# EAGLE schematic 6502_nes_book (EAGLE 6.4), part 1 of 5

## Sheet 1 of 29
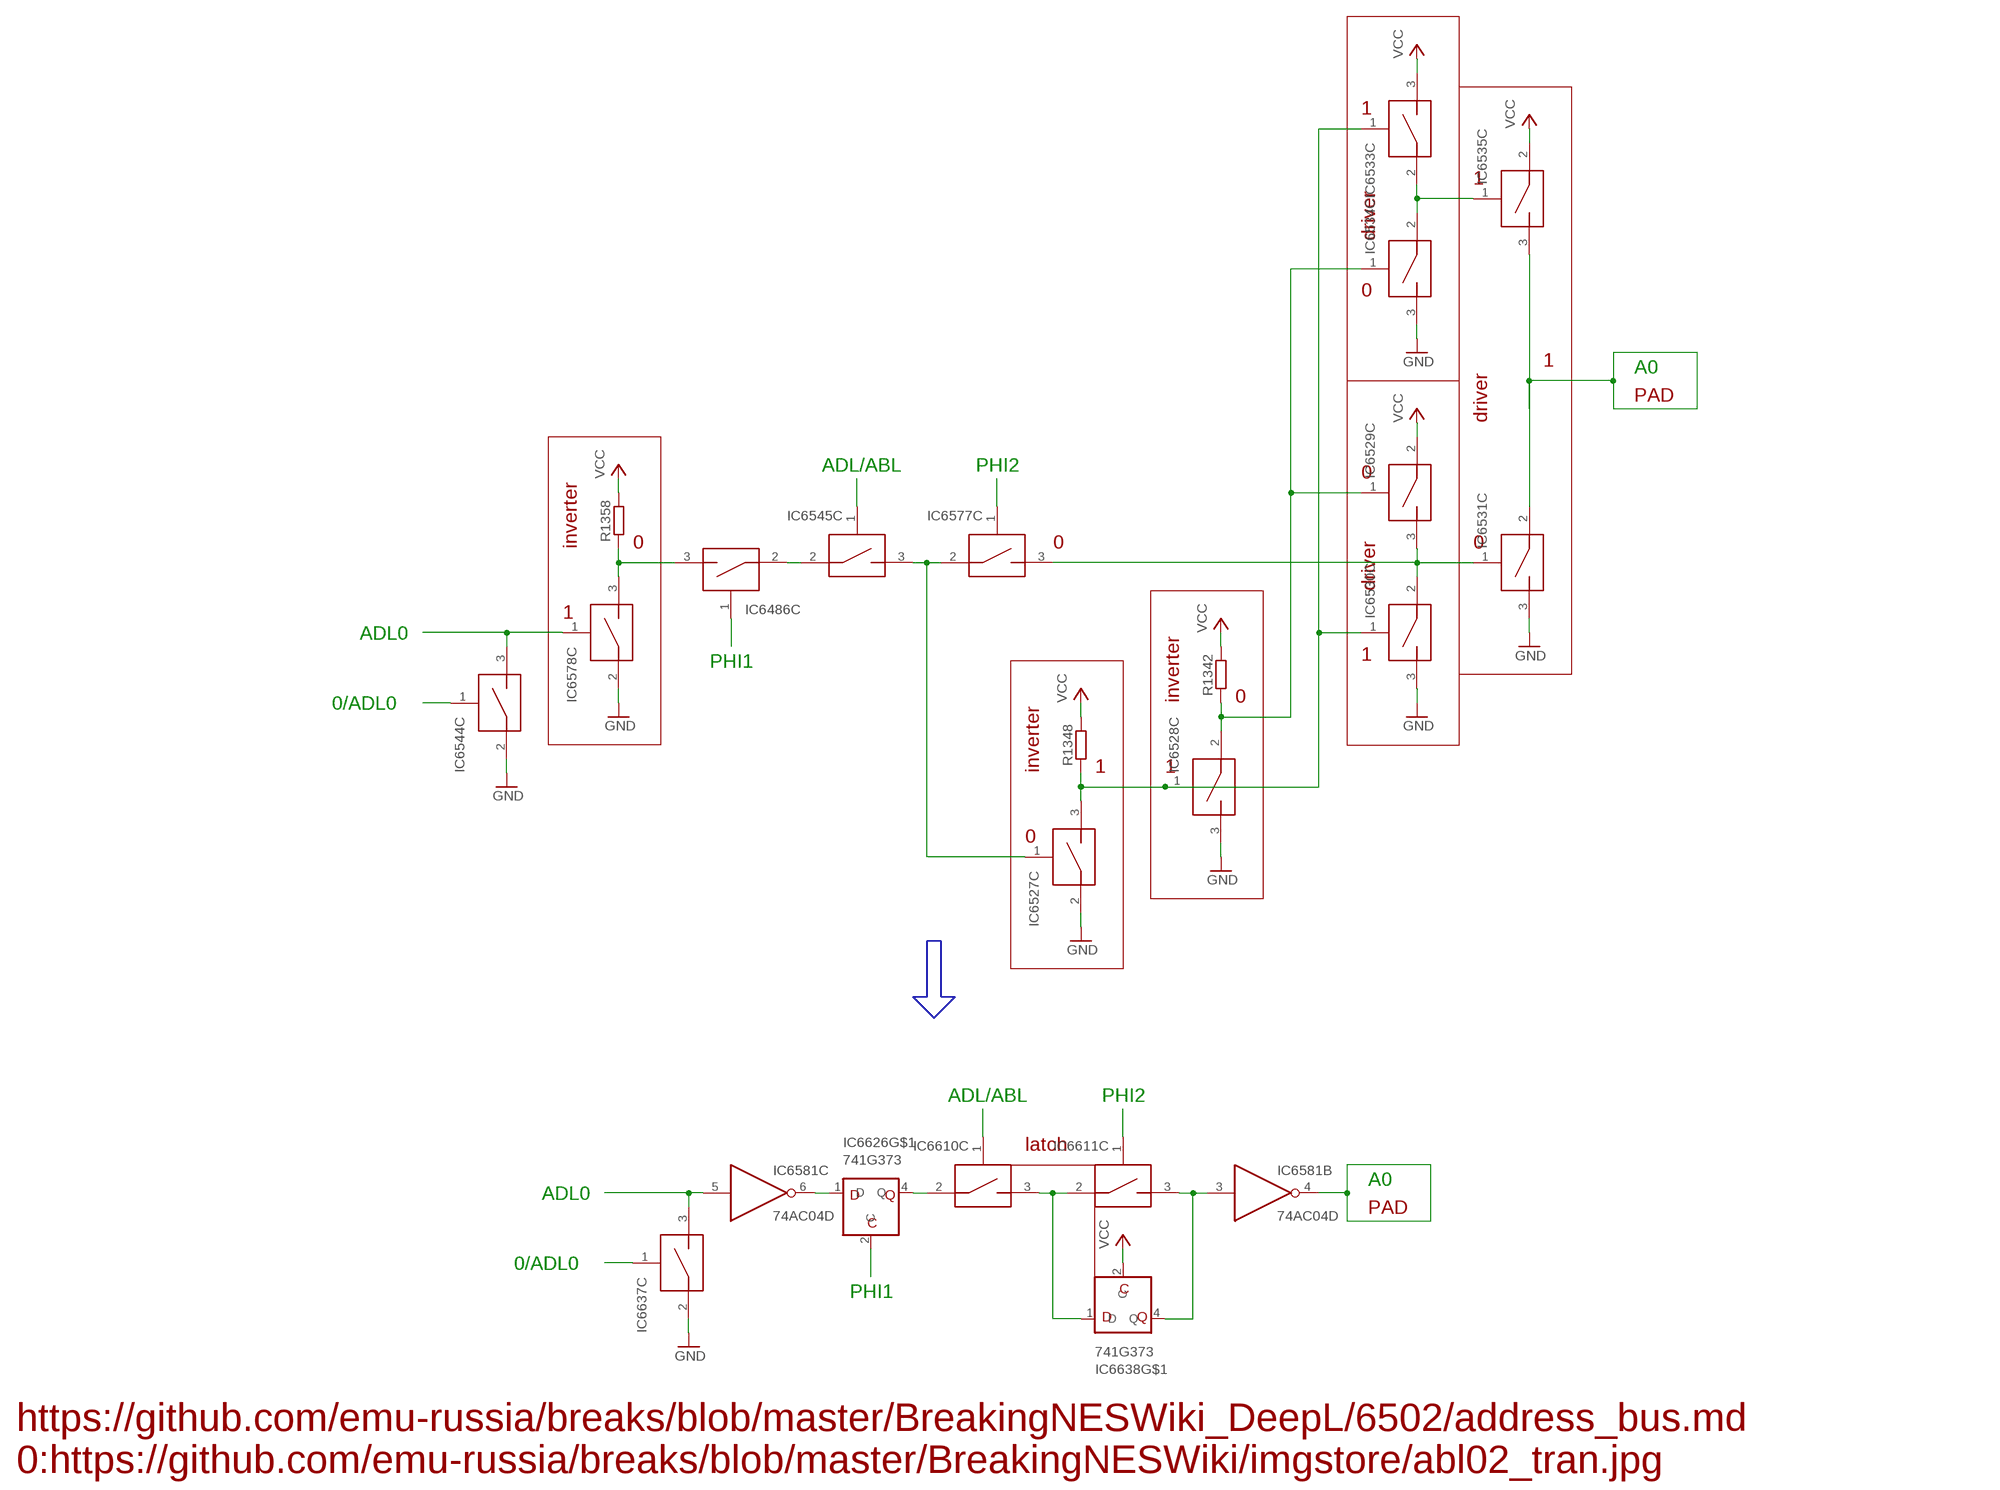
[diagram p0: schematic, sheet 1]

### Parts
IC6486  MAX4613SO16  [SO16]
IC6527  MAX4613SO16  [SO16]
IC6528  MAX4613SO16  [SO16]
IC6529  MAX4613SO16  [SO16]
IC6530  MAX4613SO16  [SO16]
IC6531  MAX4613SO16  [SO16]
IC6533  MAX4613SO16  [SO16]
IC6534  MAX4613SO16  [SO16]
IC6535  MAX4613SO16  [SO16]
IC6544  MAX4613SO16  [SO16]
IC6545  MAX4613SO16  [SO16]
IC6577  MAX4613SO16  [SO16]
IC6578  MAX4613SO16  [SO16]
IC6581  74AC04D  [SO14]
IC6610  MAX4613SO16  [SO16]
IC6611  MAX4613SO16  [SO16]
IC6626  741G373  [DBV-R-PDSO-G5]
IC6637  MAX4613SO16  [SO16]
IC6638  741G373  [DBV-R-PDSO-G5]
R1342  R-EU_R0603  [R0603]
R1348  R-EU_R0603  [R0603]
R1358  R-EU_R0603  [R0603]

### Nets
GND: IC6527.2 IC6528.3 IC6530.3 IC6531.3 IC6534.3 IC6544.2 IC6578.2 IC6637.2 ; also sheet 2,3,4,9,10,11,12,13,14,19,20,21,22,23
N$11706: IC6486.3 IC6578.3 R1358.1
N$11709: IC6544.3 IC6578.1
N$11939: IC6486.1
N$11941: IC6527.3 IC6528.1 IC6530.1 IC6533.1 R1348.1
N$11942: IC6527.1 IC6545.3 IC6577.2
N$11995: IC6533.2 IC6534.2 IC6535.1
N$12003: IC6531.2 IC6535.3
N$12008: IC6529.3 IC6530.2 IC6531.1 IC6577.3
N$12009: IC6544.1
N$12011: IC6545.1
N$12012: IC6486.2 IC6545.2
N$12013: IC6577.1
N$12015: IC6528.2 IC6529.1 IC6534.1 R1342.1
N$12016: IC6581.4(B:O)
N$12246: IC6610.1
N$12247: IC6611.1
N$12248: IC6610.3 IC6611.2 IC6638.1(D)
N$12249: IC6626.2(C)
N$12251: IC6581.5(C:I) IC6637.3
N$12252: IC6637.1
N$12253: IC6581.6(C:O) IC6626.1(D)
N$12254: IC6610.2 IC6626.4(Q)
N$12255: IC6581.3(B:I) IC6611.3 IC6638.4(Q)
VCC: IC6529.2 IC6533.3 IC6535.2 IC6638.2(C) R1342.2 R1348.2 R1358.2 ; also sheet 2,3,4,9,11,12,13,19,20,21,22,23,26
Unconnected: IC6486.4(PWR:V-) IC6486.5(PWR:GND) IC6486.6 IC6486.7 IC6486.8 IC6486.9 IC6486.10 IC6486.11 IC6486.12(PWR:VCC) IC6486.13(PWR:V+) IC6486.14 IC6486.15 IC6486.16 IC6527.4(PWR:V-) IC6527.5(PWR:GND) IC6527.6 IC6527.7 IC6527.8 IC6527.9 IC6527.10 IC6527.11 IC6527.12(PWR:VCC) IC6527.13(PWR:V+) IC6527.14 IC6527.15 IC6527.16 IC6528.4(PWR:V-) IC6528.5(PWR:GND) IC6528.6 IC6528.7 IC6528.8 IC6528.9 IC6528.10 IC6528.11 IC6528.12(PWR:VCC) IC6528.13(PWR:V+) IC6528.14 IC6528.15 IC6528.16 IC6529.4(PWR:V-) IC6529.5(PWR:GND) IC6529.6 IC6529.7 IC6529.8 IC6529.9 IC6529.10 IC6529.11 IC6529.12(PWR:VCC) IC6529.13(PWR:V+) IC6529.14 IC6529.15 IC6529.16 IC6530.4(PWR:V-) IC6530.5(PWR:GND) IC6530.6 IC6530.7 IC6530.8 IC6530.9 IC6530.10 IC6530.11 IC6530.12(PWR:VCC) IC6530.13(PWR:V+) IC6530.14 IC6530.15 IC6530.16 IC6531.4(PWR:V-) IC6531.5(PWR:GND) IC6531.6 IC6531.7 IC6531.8 IC6531.9 IC6531.10 IC6531.11 IC6531.12(PWR:VCC) IC6531.13(PWR:V+) IC6531.14 IC6531.15 IC6531.16 IC6533.4(PWR:V-) IC6533.5(PWR:GND) IC6533.6 IC6533.7 IC6533.8 IC6533.9 IC6533.10 IC6533.11 IC6533.12(PWR:VCC) IC6533.13(PWR:V+) IC6533.14 IC6533.15 IC6533.16 IC6534.4(PWR:V-) IC6534.5(PWR:GND) IC6534.6 IC6534.7 IC6534.8 IC6534.9 IC6534.10 IC6534.11 IC6534.12(PWR:VCC) IC6534.13(PWR:V+) IC6534.14 IC6534.15 IC6534.16 IC6535.4(PWR:V-) IC6535.5(PWR:GND) IC6535.6 IC6535.7 IC6535.8 IC6535.9 IC6535.10 IC6535.11 IC6535.12(PWR:VCC) IC6535.13(PWR:V+) IC6535.14 IC6535.15 IC6535.16 IC6544.4(PWR:V-) IC6544.5(PWR:GND) IC6544.6 IC6544.7 IC6544.8 IC6544.9 IC6544.10 IC6544.11 IC6544.12(PWR:VCC) IC6544.13(PWR:V+) IC6544.14 IC6544.15 IC6544.16 IC6545.4(PWR:V-) IC6545.5(PWR:GND) IC6545.6 IC6545.7 IC6545.8 IC6545.9 IC6545.10 IC6545.11 IC6545.12(PWR:VCC) IC6545.13(PWR:V+) IC6545.14 IC6545.15 IC6545.16 IC6577.4(PWR:V-) IC6577.5(PWR:GND) IC6577.6 IC6577.7 IC6577.8 IC6577.9 IC6577.10 IC6577.11 IC6577.12(PWR:VCC) IC6577.13(PWR:V+) IC6577.14 IC6577.15 IC6577.16 IC6578.4(PWR:V-) IC6578.5(PWR:GND) IC6578.6 IC6578.7 IC6578.8 IC6578.9 IC6578.10 IC6578.11 IC6578.12(PWR:VCC) IC6578.13(PWR:V+) IC6578.14 IC6578.15 IC6578.16 IC6581.1(A:I) IC6581.2(A:O) IC6581.8(D:O) IC6581.9(D:I) IC6581.10(E:O) IC6581.11(E:I) IC6581.12(F:O) IC6581.13(F:I) IC6610.4(PWR:V-) IC6610.5(PWR:GND) IC6610.6 IC6610.7 IC6610.8 IC6610.9 IC6610.10 IC6610.11 IC6610.12(PWR:VCC) IC6610.13(PWR:V+) IC6610.14 IC6610.15 IC6610.16 IC6611.4(PWR:V-) IC6611.5(PWR:GND) IC6611.6 IC6611.7 IC6611.8 IC6611.9 IC6611.10 IC6611.11 IC6611.12(PWR:VCC) IC6611.13(PWR:V+) IC6611.14 IC6611.15 IC6611.16 IC6637.4(PWR:V-) IC6637.5(PWR:GND) IC6637.6 IC6637.7 IC6637.8 IC6637.9 IC6637.10 IC6637.11 IC6637.12(PWR:VCC) IC6637.13(PWR:V+) IC6637.14 IC6637.15 IC6637.16

### Buses
B$12

### Notes on the sheet
- 1
- 1
- driver
- 0
- 1
- A0
- PAD
- driver
- ADL/ABL | PHI2
- 0
- inverter | 0 | 0 | 0
- driver
- 1
- ADL0
- 1
- PHI1
- inverter | 0
- 0/ADL0
- inverter | 1 | 1
- 0
- ADL/ABL | PHI2
- latch
- A0
- ADL0
- PAD
- 0/ADL0
- PHI1
- https://github.com/emu-russia/breaks/blob/master/BreakingNESWiki_DeepL/6502/address_bus.md
  0:https://github.com/emu-russia/breaks/blob/master/BreakingNESWiki/imgstore/abl02_tran.jpg

## Sheet 2 of 29
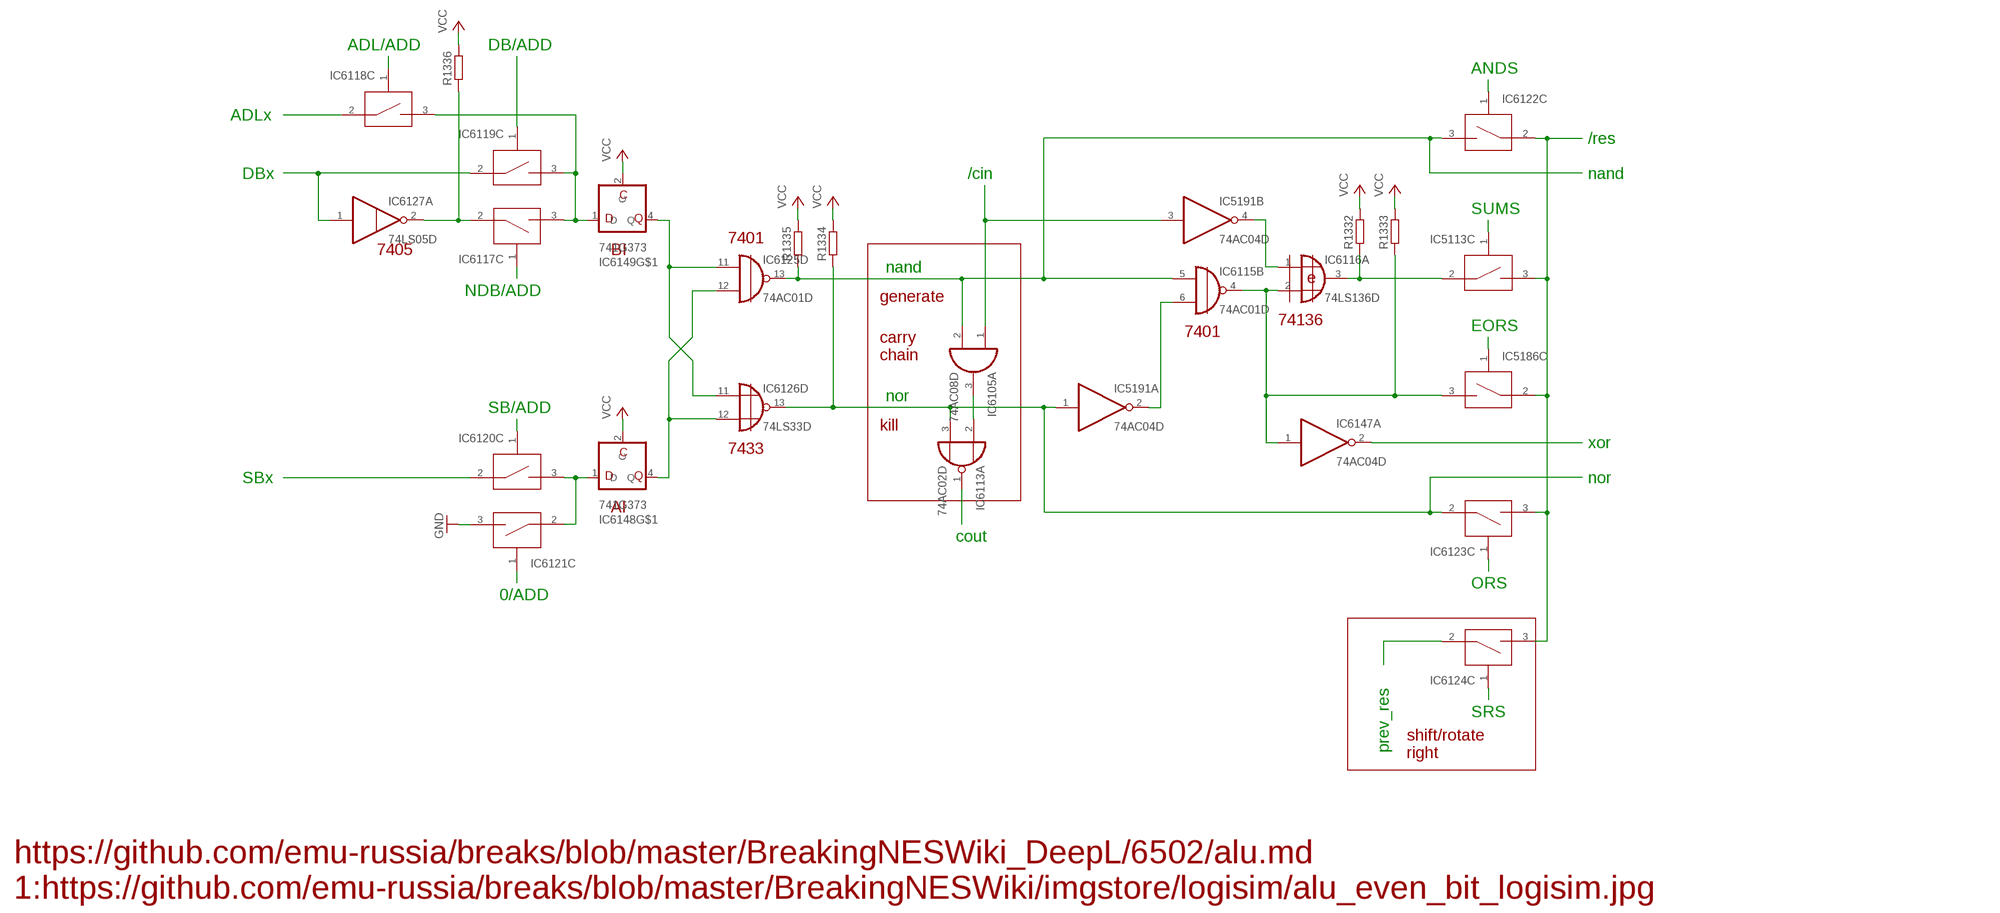
[diagram p1: schematic, sheet 2]

### Parts
IC5113  MAX4613SO16  [SO16]
IC5186  MAX4613SO16  [SO16]
IC5191  74AC04D  [SO14]
IC6105  74AC08D  [SO14]
IC6113  74AC02D  [SO14]
IC6115  74AC01D  [SO14]
IC6116  74LS136D  [DIL14]
IC6117  MAX4613SO16  [SO16]
IC6118  MAX4613SO16  [SO16]
IC6119  MAX4613SO16  [SO16]
IC6120  MAX4613SO16  [SO16]
IC6121  MAX4613SO16  [SO16]
IC6122  MAX4613SO16  [SO16]
IC6123  MAX4613SO16  [SO16]
IC6124  MAX4613SO16  [SO16]
IC6125  74AC01D  [SO14]
IC6126  74LS33D  [SO14]
IC6127  74LS05D  [SO14]
IC6147  74AC04D  [SO14]
IC6148  741G373  [DBV-R-PDSO-G5]
IC6149  741G373  [DBV-R-PDSO-G5]
R1332  R-EU_R0603  [R0603]
R1333  R-EU_R0603  [R0603]
R1334  R-EU_R0603  [R0603]
R1335  R-EU_R0603  [R0603]
R1336  R-EU_R0603  [R0603]

### Nets
GND: IC6121.3 ; also sheet 1,3,4,9,10,11,12,13,14,19,20,21,22,23
N$10663: IC6113.1(A:O)
N$10667: IC5113.2 IC6116.3(A:O) R1332.1
N$10669: IC5113.1
N$10670: IC5186.1
N$10671: IC5191.1(A:I) IC6113.3(A:I1) IC6123.2 IC6126.13(D:O) R1334.1
N$10672: IC5191.3(B:I) IC6105.1(A:I0)
N$10673: IC6105.2(A:I1) IC6115.5(B:I0) IC6122.3 IC6125.13(D:O) R1335.1
N$10674: IC6147.2(A:O)
N$10677: IC5191.2(A:O) IC6115.6(B:I1)
N$10681: IC6105.3(A:O) IC6113.2(A:I0)
N$10682: IC5191.4(B:O) IC6116.1(A:I0)
N$10683: IC5186.3 IC6115.4(B:O) IC6116.2(A:I1) IC6147.1(A:I) R1333.1
N$10684: IC6120.2
N$10685: IC6117.1
N$10686: IC6118.2
N$10688: IC6117.2 IC6127.2(A:O) R1336.1
N$10690: IC6119.2 IC6127.1(A:I)
N$10691: IC6118.1
N$10693: IC6119.1
N$10712: IC6117.3 IC6118.3 IC6119.3 IC6149.1(D)
N$10782: IC6120.1
N$10806: IC6121.1
N$10807: IC6125.12(D:I1) IC6126.12(D:I1) IC6148.4(Q)
N$10808: IC6120.3 IC6121.2 IC6148.1(D)
N$10809: IC6125.11(D:I0) IC6126.11(D:I0) IC6149.4(Q)
N$10810: IC6123.1
N$10811: IC6122.1
N$10812: IC6124.1
N$10813: IC5113.3 IC5186.2 IC6122.2 IC6123.3 IC6124.3
N$10814: IC6124.2
VCC: IC6148.2(C) IC6149.2(C) R1332.2 R1333.2 R1334.2 R1335.2 R1336.2 ; also sheet 1,3,4,9,11,12,13,19,20,21,22,23,26
Unconnected: IC5113.4(PWR:V-) IC5113.5(PWR:GND) IC5113.6 IC5113.7 IC5113.8 IC5113.9 IC5113.10 IC5113.11 IC5113.12(PWR:VCC) IC5113.13(PWR:V+) IC5113.14 IC5113.15 IC5113.16 IC5186.4(PWR:V-) IC5186.5(PWR:GND) IC5186.6 IC5186.7 IC5186.8 IC5186.9 IC5186.10 IC5186.11 IC5186.12(PWR:VCC) IC5186.13(PWR:V+) IC5186.14 IC5186.15 IC5186.16 IC5191.5(C:I) IC5191.6(C:O) IC5191.8(D:O) IC5191.9(D:I) IC5191.10(E:O) IC5191.11(E:I) IC5191.12(F:O) IC5191.13(F:I) IC6105.4(B:I0) IC6105.5(B:I1) IC6105.6(B:O) IC6105.8(C:O) IC6105.9(C:I0) IC6105.10(C:I1) IC6105.11(D:O) IC6105.12(D:I0) IC6105.13(D:I1) IC6113.4(B:O) IC6113.5(B:I0) IC6113.6(B:I1) IC6113.8(C:I0) IC6113.9(C:I1) IC6113.10(C:O) IC6113.11(D:I0) IC6113.12(D:I1) IC6113.13(D:O) IC6115.1(A:O) IC6115.2(A:I0) IC6115.3(A:I1) IC6115.8(C:I0) IC6115.9(C:I1) IC6115.10(C:O) IC6115.11(D:I0) IC6115.12(D:I1) IC6115.13(D:O) IC6116.4(B:I0) IC6116.5(B:I1) IC6116.6(B:O) IC6116.8(C:O) IC6116.9(C:I0) IC6116.10(C:I1) IC6116.11(D:O) IC6116.12(D:I0) IC6116.13(D:I1) IC6117.4(PWR:V-) IC6117.5(PWR:GND) IC6117.6 IC6117.7 IC6117.8 IC6117.9 IC6117.10 IC6117.11 IC6117.12(PWR:VCC) IC6117.13(PWR:V+) IC6117.14 IC6117.15 IC6117.16 IC6118.4(PWR:V-) IC6118.5(PWR:GND) IC6118.6 IC6118.7 IC6118.8 IC6118.9 IC6118.10 IC6118.11 IC6118.12(PWR:VCC) IC6118.13(PWR:V+) IC6118.14 IC6118.15 IC6118.16 IC6119.4(PWR:V-) IC6119.5(PWR:GND) IC6119.6 IC6119.7 IC6119.8 IC6119.9 IC6119.10 IC6119.11 IC6119.12(PWR:VCC) IC6119.13(PWR:V+) IC6119.14 IC6119.15 IC6119.16 IC6120.4(PWR:V-) IC6120.5(PWR:GND) IC6120.6 IC6120.7 IC6120.8 IC6120.9 IC6120.10 IC6120.11 IC6120.12(PWR:VCC) IC6120.13(PWR:V+) IC6120.14 IC6120.15 IC6120.16 IC6121.4(PWR:V-) IC6121.5(PWR:GND) IC6121.6 IC6121.7 IC6121.8 IC6121.9 IC6121.10 IC6121.11 IC6121.12(PWR:VCC) IC6121.13(PWR:V+) IC6121.14 IC6121.15 IC6121.16 IC6122.4(PWR:V-) IC6122.5(PWR:GND) IC6122.6 IC6122.7 IC6122.8 IC6122.9 IC6122.10 IC6122.11 IC6122.12(PWR:VCC) IC6122.13(PWR:V+) IC6122.14 IC6122.15 IC6122.16 IC6123.4(PWR:V-) IC6123.5(PWR:GND) IC6123.6 IC6123.7 IC6123.8 IC6123.9 IC6123.10 IC6123.11 IC6123.12(PWR:VCC) IC6123.13(PWR:V+) IC6123.14 IC6123.15 IC6123.16 IC6124.4(PWR:V-) IC6124.5(PWR:GND) IC6124.6 IC6124.7 IC6124.8 IC6124.9 IC6124.10 IC6124.11 IC6124.12(PWR:VCC) IC6124.13(PWR:V+) IC6124.14 IC6124.15 IC6124.16 IC6125.1(A:O) IC6125.2(A:I0) IC6125.3(A:I1) IC6125.4(B:O) IC6125.5(B:I0) IC6125.6(B:I1) IC6125.8(C:I0) IC6125.9(C:I1) IC6125.10(C:O) IC6126.1(A:O) IC6126.2(A:I0) IC6126.3(A:I1) IC6126.4(B:O) IC6126.5(B:I0) IC6126.6(B:I1) IC6126.8(C:I0) IC6126.9(C:I1) IC6126.10(C:O) IC6127.3(B:I) IC6127.4(B:O) IC6127.5(C:I) IC6127.6(C:O) IC6127.8(D:O) IC6127.9(D:I) IC6127.10(E:O) IC6127.11(E:I) IC6127.12(F:O) IC6127.13(F:I) IC6147.3(B:I) IC6147.4(B:O) IC6147.5(C:I) IC6147.6(C:O) IC6147.8(D:O) IC6147.9(D:I) IC6147.10(E:O) IC6147.11(E:I) IC6147.12(F:O) IC6147.13(F:I)

### Notes on the sheet
- ADL/ADD | DB/ADD
- ANDS
- ADLx
- /res
- DBx | /cin | nand
- SUMS
- 7401
- 7405 | BI
- nand
- NDB/ADD
- generate
- 74136
- EORS
- 7401
- carry
  chain
- nor
- SB/ADD
- kill
- xor
- 7433
- SBx | nor
- AI
- cout
- ORS
- 0/ADD
- SRS
- prev_res
- shift/rotate
  right
- https://github.com/emu-russia/breaks/blob/master/BreakingNESWiki_DeepL/6502/alu.md
  1:https://github.com/emu-russia/breaks/blob/master/BreakingNESWiki/imgstore/logisim/alu_even_bit_logisim.jpg

## Sheet 3 of 29
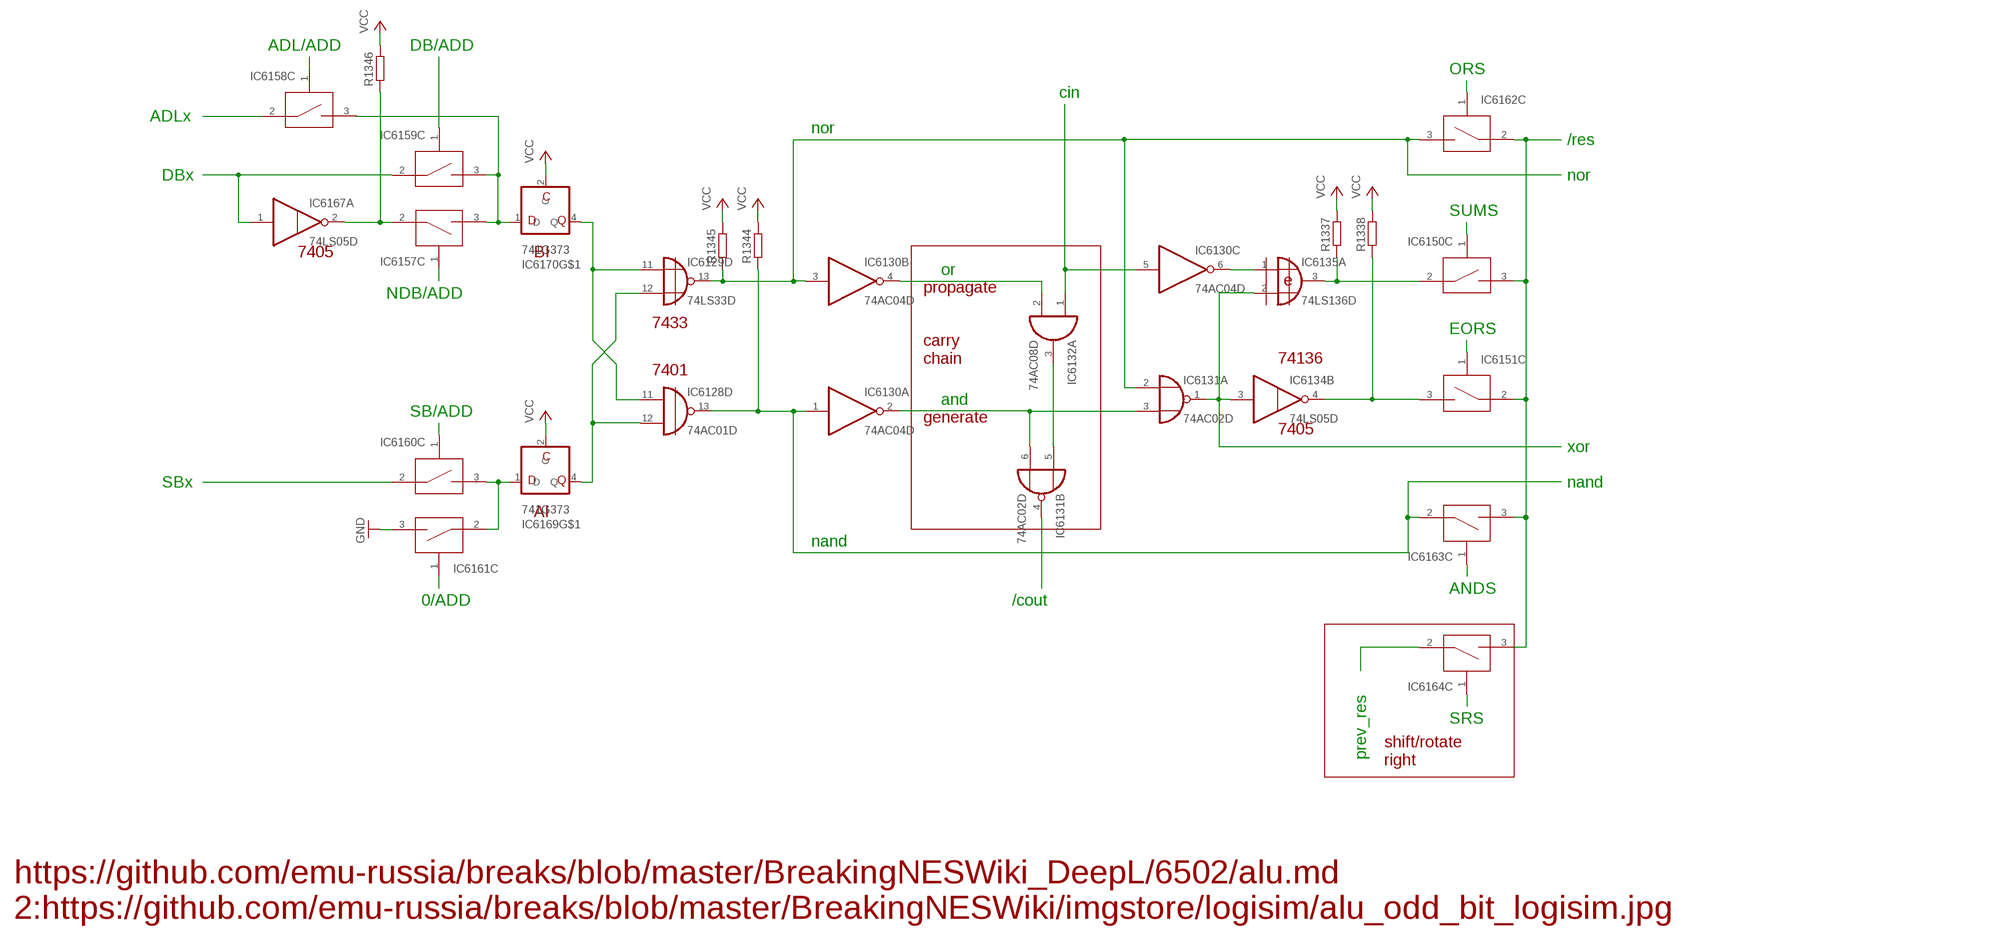
[diagram p2: schematic, sheet 3]

### Parts
IC6128  74AC01D  [SO14]
IC6129  74LS33D  [SO14]
IC6130  74AC04D  [SO14]
IC6131  74AC02D  [SO14]
IC6132  74AC08D  [SO14]
IC6134  74LS05D  [SO14]
IC6135  74LS136D  [DIL14]
IC6150  MAX4613SO16  [SO16]
IC6151  MAX4613SO16  [SO16]
IC6157  MAX4613SO16  [SO16]
IC6158  MAX4613SO16  [SO16]
IC6159  MAX4613SO16  [SO16]
IC6160  MAX4613SO16  [SO16]
IC6161  MAX4613SO16  [SO16]
IC6162  MAX4613SO16  [SO16]
IC6163  MAX4613SO16  [SO16]
IC6164  MAX4613SO16  [SO16]
IC6167  74LS05D  [SO14]
IC6169  741G373  [DBV-R-PDSO-G5]
IC6170  741G373  [DBV-R-PDSO-G5]
R1337  R-EU_R0603  [R0603]
R1338  R-EU_R0603  [R0603]
R1344  R-EU_R0603  [R0603]
R1345  R-EU_R0603  [R0603]
R1346  R-EU_R0603  [R0603]

### Nets
GND: IC6161.3 ; also sheet 1,2,4,9,10,11,12,13,14,19,20,21,22,23
N$10815: IC6128.13(D:O) IC6130.1(A:I) IC6163.2 R1344.1
N$10816: IC6131.4(B:O)
N$10817: IC6131.1(A:O) IC6134.3(B:I) IC6135.2(A:I1)
N$10818: IC6134.4(B:O) IC6151.3 R1338.1
N$10822: IC6130.4(B:O) IC6132.2(A:I1)
N$10823: IC6130.2(A:O) IC6131.3(A:I1) IC6131.6(B:I1)
N$10824: IC6130.5(C:I) IC6132.1(A:I0)
N$10825: IC6135.3(A:O) IC6150.2 R1337.1
N$10827: IC6130.6(C:O) IC6135.1(A:I0)
N$10829: IC6131.5(B:I0) IC6132.3(A:O)
N$10850: IC6150.1
N$10851: IC6151.1
N$10854: IC6129.13(D:O) IC6130.3(B:I) IC6131.2(A:I0) IC6162.3 R1345.1
N$10859: IC6160.2
N$10860: IC6157.1
N$10861: IC6158.2
N$10862: IC6157.2 IC6167.2(A:O) R1346.1
N$10863: IC6159.2 IC6167.1(A:I)
N$10864: IC6158.1
N$10865: IC6159.1
N$10866: IC6157.3 IC6158.3 IC6159.3 IC6170.1(D)
N$10867: IC6160.1
N$10868: IC6161.1
N$10869: IC6128.12(D:I1) IC6129.12(D:I1) IC6169.4(Q)
N$10870: IC6163.1
N$10871: IC6162.1
N$10872: IC6164.1
N$10873: IC6150.3 IC6151.2 IC6162.2 IC6163.3 IC6164.3
N$10874: IC6164.2
N$10876: IC6160.3 IC6161.2 IC6169.1(D)
N$10877: IC6128.11(D:I0) IC6129.11(D:I0) IC6170.4(Q)
VCC: IC6169.2(C) IC6170.2(C) R1337.2 R1338.2 R1344.2 R1345.2 R1346.2 ; also sheet 1,2,4,9,11,12,13,19,20,21,22,23,26
Unconnected: IC6128.1(A:O) IC6128.2(A:I0) IC6128.3(A:I1) IC6128.4(B:O) IC6128.5(B:I0) IC6128.6(B:I1) IC6128.8(C:I0) IC6128.9(C:I1) IC6128.10(C:O) IC6129.1(A:O) IC6129.2(A:I0) IC6129.3(A:I1) IC6129.4(B:O) IC6129.5(B:I0) IC6129.6(B:I1) IC6129.8(C:I0) IC6129.9(C:I1) IC6129.10(C:O) IC6130.8(D:O) IC6130.9(D:I) IC6130.10(E:O) IC6130.11(E:I) IC6130.12(F:O) IC6130.13(F:I) IC6131.8(C:I0) IC6131.9(C:I1) IC6131.10(C:O) IC6131.11(D:I0) IC6131.12(D:I1) IC6131.13(D:O) IC6132.4(B:I0) IC6132.5(B:I1) IC6132.6(B:O) IC6132.8(C:O) IC6132.9(C:I0) IC6132.10(C:I1) IC6132.11(D:O) IC6132.12(D:I0) IC6132.13(D:I1) IC6134.1(A:I) IC6134.2(A:O) IC6134.5(C:I) IC6134.6(C:O) IC6134.8(D:O) IC6134.9(D:I) IC6134.10(E:O) IC6134.11(E:I) IC6134.12(F:O) IC6134.13(F:I) IC6135.4(B:I0) IC6135.5(B:I1) IC6135.6(B:O) IC6135.8(C:O) IC6135.9(C:I0) IC6135.10(C:I1) IC6135.11(D:O) IC6135.12(D:I0) IC6135.13(D:I1) IC6150.4(PWR:V-) IC6150.5(PWR:GND) IC6150.6 IC6150.7 IC6150.8 IC6150.9 IC6150.10 IC6150.11 IC6150.12(PWR:VCC) IC6150.13(PWR:V+) IC6150.14 IC6150.15 IC6150.16 IC6151.4(PWR:V-) IC6151.5(PWR:GND) IC6151.6 IC6151.7 IC6151.8 IC6151.9 IC6151.10 IC6151.11 IC6151.12(PWR:VCC) IC6151.13(PWR:V+) IC6151.14 IC6151.15 IC6151.16 IC6157.4(PWR:V-) IC6157.5(PWR:GND) IC6157.6 IC6157.7 IC6157.8 IC6157.9 IC6157.10 IC6157.11 IC6157.12(PWR:VCC) IC6157.13(PWR:V+) IC6157.14 IC6157.15 IC6157.16 IC6158.4(PWR:V-) IC6158.5(PWR:GND) IC6158.6 IC6158.7 IC6158.8 IC6158.9 IC6158.10 IC6158.11 IC6158.12(PWR:VCC) IC6158.13(PWR:V+) IC6158.14 IC6158.15 IC6158.16 IC6159.4(PWR:V-) IC6159.5(PWR:GND) IC6159.6 IC6159.7 IC6159.8 IC6159.9 IC6159.10 IC6159.11 IC6159.12(PWR:VCC) IC6159.13(PWR:V+) IC6159.14 IC6159.15 IC6159.16 IC6160.4(PWR:V-) IC6160.5(PWR:GND) IC6160.6 IC6160.7 IC6160.8 IC6160.9 IC6160.10 IC6160.11 IC6160.12(PWR:VCC) IC6160.13(PWR:V+) IC6160.14 IC6160.15 IC6160.16 IC6161.4(PWR:V-) IC6161.5(PWR:GND) IC6161.6 IC6161.7 IC6161.8 IC6161.9 IC6161.10 IC6161.11 IC6161.12(PWR:VCC) IC6161.13(PWR:V+) IC6161.14 IC6161.15 IC6161.16 IC6162.4(PWR:V-) IC6162.5(PWR:GND) IC6162.6 IC6162.7 IC6162.8 IC6162.9 IC6162.10 IC6162.11 IC6162.12(PWR:VCC) IC6162.13(PWR:V+) IC6162.14 IC6162.15 IC6162.16 IC6163.4(PWR:V-) IC6163.5(PWR:GND) IC6163.6 IC6163.7 IC6163.8 IC6163.9 IC6163.10 IC6163.11 IC6163.12(PWR:VCC) IC6163.13(PWR:V+) IC6163.14 IC6163.15 IC6163.16 IC6164.4(PWR:V-) IC6164.5(PWR:GND) IC6164.6 IC6164.7 IC6164.8 IC6164.9 IC6164.10 IC6164.11 IC6164.12(PWR:VCC) IC6164.13(PWR:V+) IC6164.14 IC6164.15 IC6164.16 IC6167.3(B:I) IC6167.4(B:O) IC6167.5(C:I) IC6167.6(C:O) IC6167.8(D:O) IC6167.9(D:I) IC6167.10(E:O) IC6167.11(E:I) IC6167.12(F:O) IC6167.13(F:I)

### Notes on the sheet
- ADL/ADD | DB/ADD
- ORS
- cin
- ADLx
- nor
- /res
- DBx | nor
- SUMS
- 7405 | BI
- or
- propagate
- NDB/ADD
- 7433
- EORS
- carry
  chain
- 74136
- 7401
- and
- SB/ADD
- generate
- 7405
- xor
- SBx | nand
- AI
- nand
- ANDS
- 0/ADD | /cout
- SRS
- prev_res
- shift/rotate
  right
- https://github.com/emu-russia/breaks/blob/master/BreakingNESWiki_DeepL/6502/alu.md
  2:https://github.com/emu-russia/breaks/blob/master/BreakingNESWiki/imgstore/logisim/alu_odd_bit_logisim.jpg

## Sheet 4 of 29
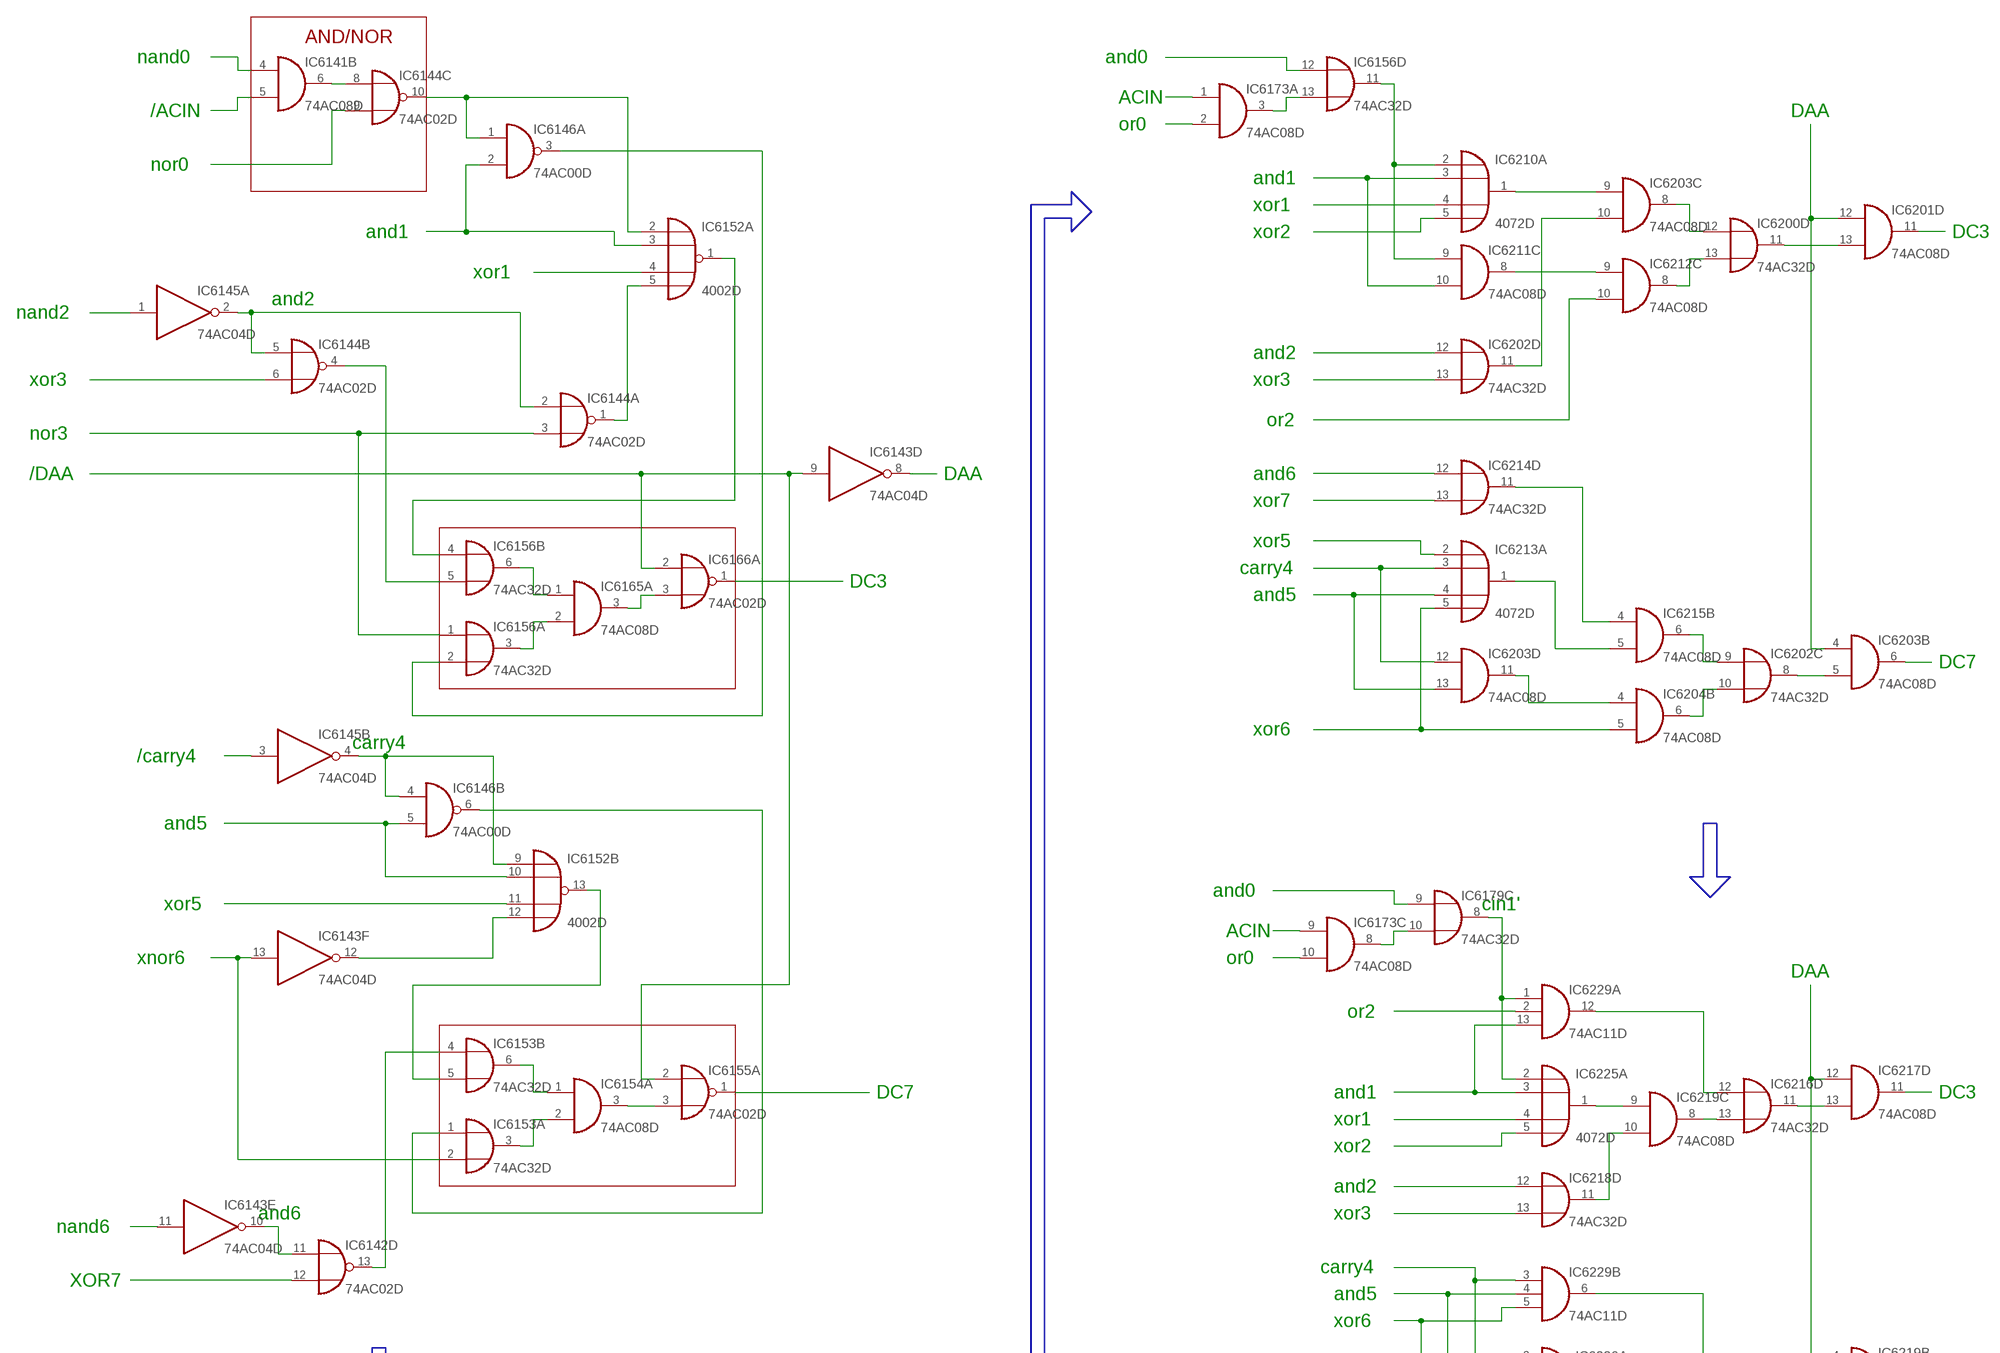
[diagram p3: schematic, sheet 4, part 1 of 2]
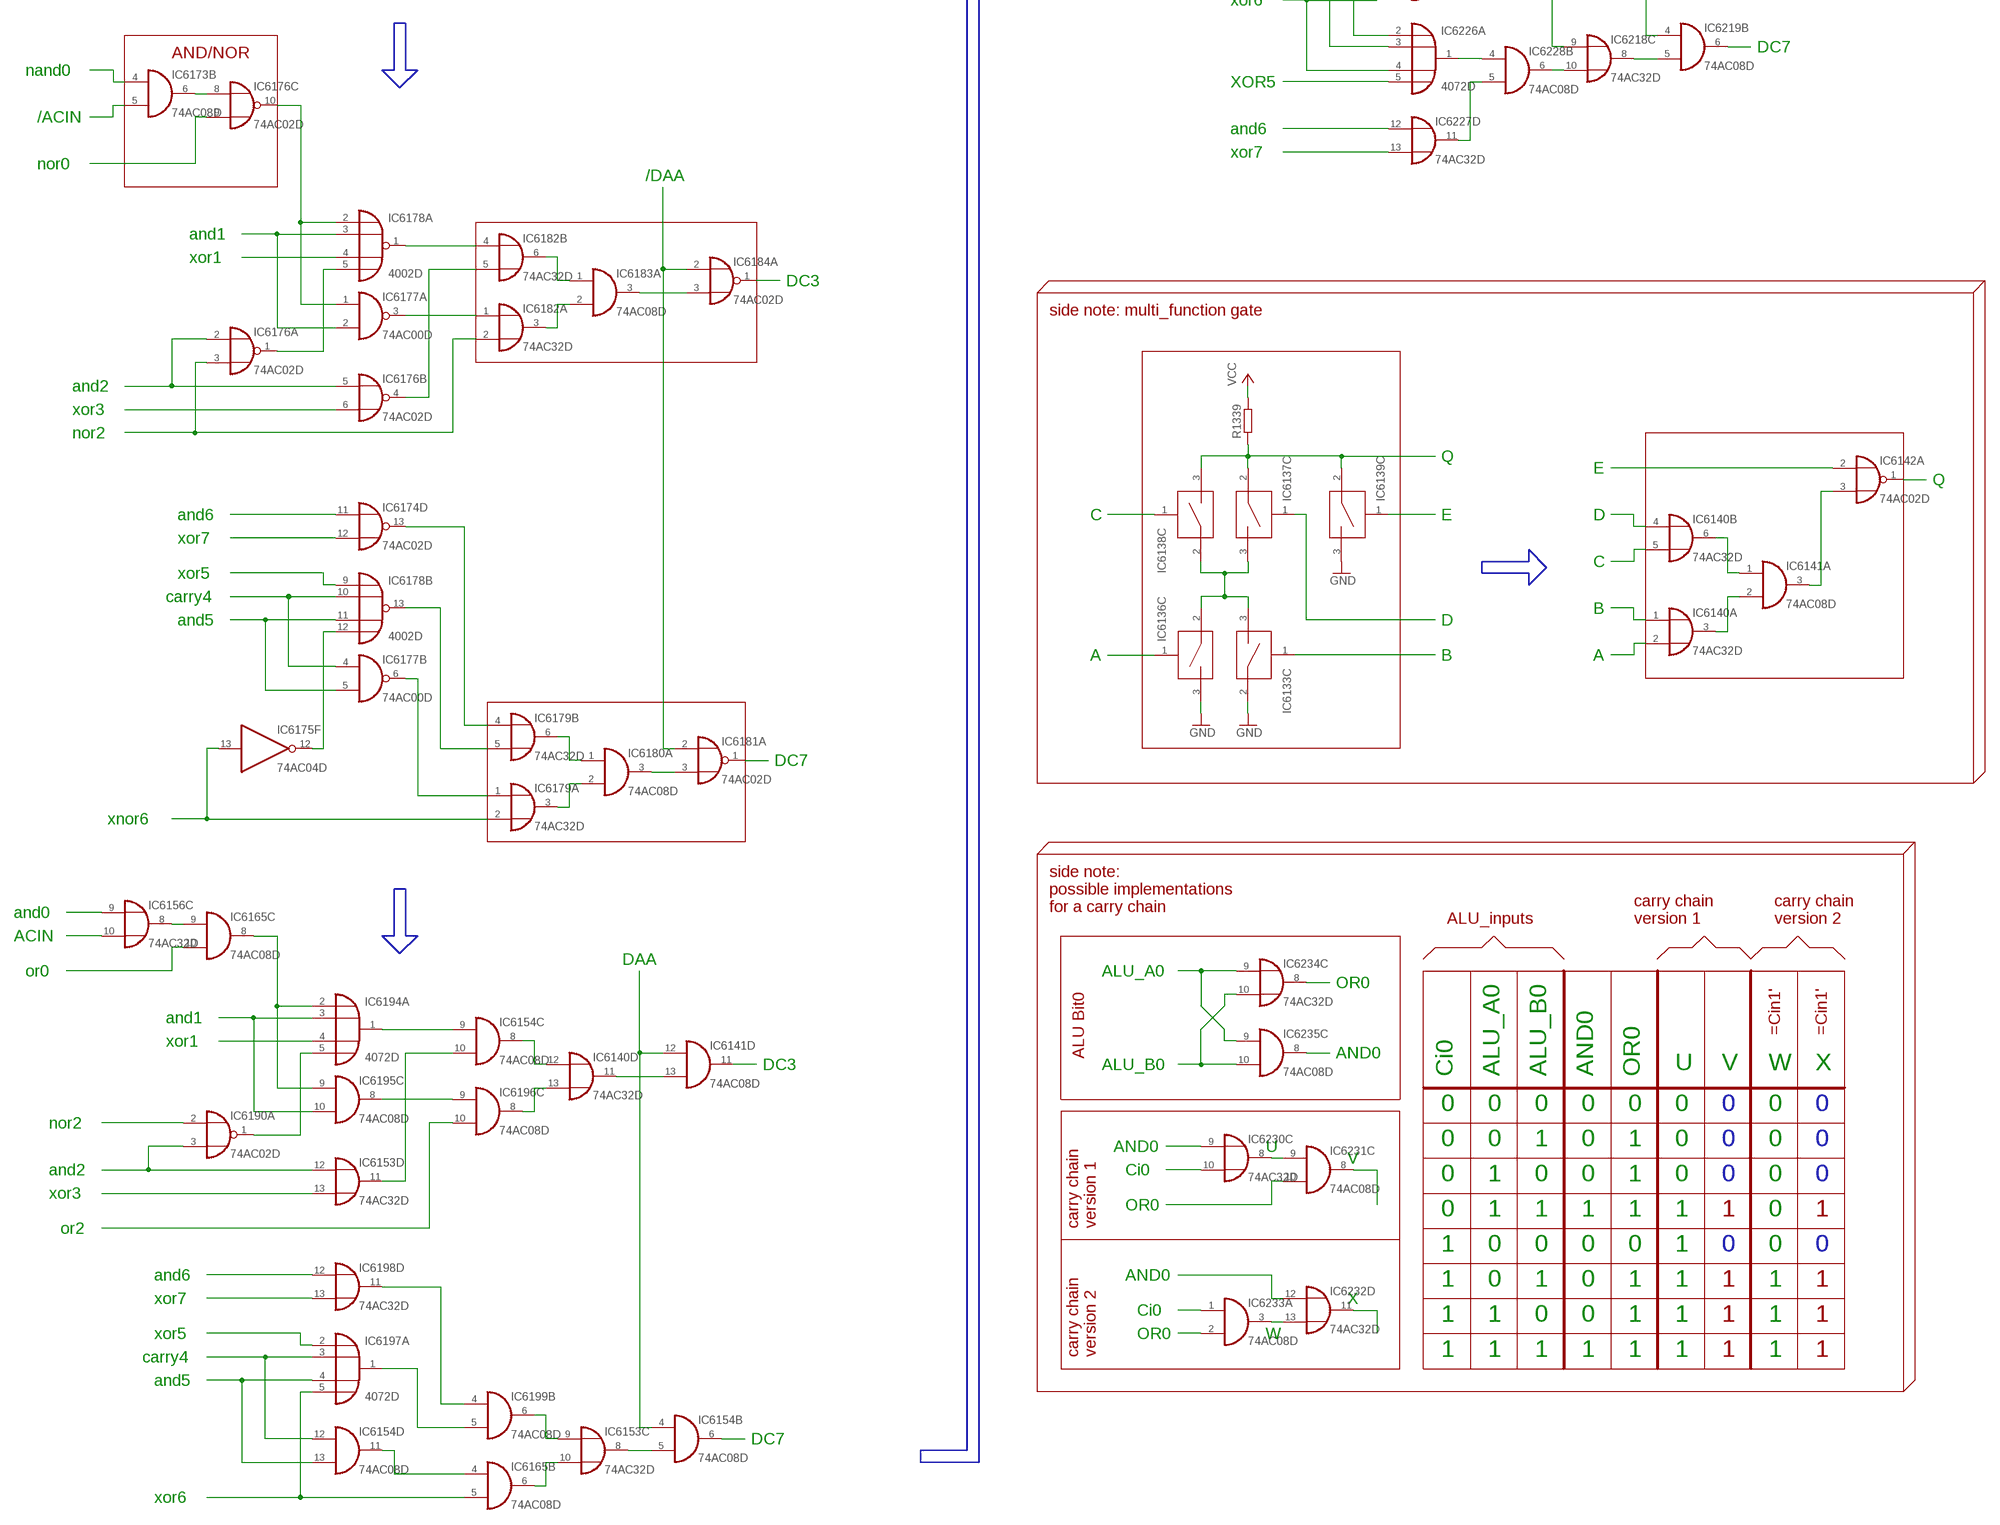
[diagram p4: schematic, sheet 4, part 2 of 2]

### Parts
IC6133  MAX4613SO16  [SO16]
IC6136  MAX4613SO16  [SO16]
IC6137  MAX4613SO16  [SO16]
IC6138  MAX4613SO16  [SO16]
IC6139  MAX4613SO16  [SO16]
IC6140  74AC32D  [SO14]
IC6141  74AC08D  [SO14]
IC6142  74AC02D  [SO14]
IC6143  74AC04D  [SO14]
IC6144  74AC02D  [SO14]
IC6145  74AC04D  [SO14]
IC6146  74AC00D  [SO14]
IC6152  4002D  [SO14]
IC6153  74AC32D  [SO14]
IC6154  74AC08D  [SO14]
IC6155  74AC02D  [SO14]
IC6156  74AC32D  [SO14]
IC6165  74AC08D  [SO14]
IC6166  74AC02D  [SO14]
IC6173  74AC08D  [SO14]
IC6174  74AC02D  [SO14]
IC6175  74AC04D  [SO14]
IC6176  74AC02D  [SO14]
IC6177  74AC00D  [SO14]
IC6178  4002D  [SO14]
IC6179  74AC32D  [SO14]
IC6180  74AC08D  [SO14]
IC6181  74AC02D  [SO14]
IC6182  74AC32D  [SO14]
IC6183  74AC08D  [SO14]
IC6184  74AC02D  [SO14]
IC6190  74AC02D  [SO14]
IC6194  4072D  [SO14]
IC6195  74AC08D  [SO14]
IC6196  74AC08D  [SO14]
IC6197  4072D  [SO14]
IC6198  74AC32D  [SO14]
IC6199  74AC08D  [SO14]
IC6200  74AC32D  [SO14]
IC6201  74AC08D  [SO14]
IC6202  74AC32D  [SO14]
IC6203  74AC08D  [SO14]
IC6204  74AC08D  [SO14]
IC6210  4072D  [SO14]
IC6211  74AC08D  [SO14]
IC6212  74AC08D  [SO14]
IC6213  4072D  [SO14]
IC6214  74AC32D  [SO14]
IC6215  74AC08D  [SO14]
IC6216  74AC32D  [SO14]
IC6217  74AC08D  [SO14]
IC6218  74AC32D  [SO14]
IC6219  74AC08D  [SO14]
IC6225  4072D  [SO14]
IC6226  4072D  [SO14]
IC6227  74AC32D  [SO14]
IC6228  74AC08D  [SO14]
IC6229  74AC11D  [SO14]
IC6230  74AC32D  [SO14]
IC6231  74AC08D  [SO14]
IC6232  74AC32D  [SO14]
IC6233  74AC08D  [SO14]
IC6234  74AC32D  [SO14]
IC6235  74AC08D  [SO14]
R1339  R-EU_R0603  [R0603]

### Nets
GND: IC6133.2 IC6136.3 IC6139.3 ; also sheet 1,2,3,9,10,11,12,13,14,19,20,21,22,23
N$10819: IC6139.1
N$10820: IC6133.1
N$10821: IC6138.1
N$10826: IC6137.2 IC6138.3 IC6139.2 R1339.1
N$10828: IC6133.3 IC6136.2 IC6137.3 IC6138.2
N$10830: IC6137.1
N$10831: IC6136.1
N$10832: IC6140.2(A:I1)
N$10833: IC6140.1(A:I0)
N$10834: IC6140.5(B:I1)
N$10835: IC6140.4(B:I0)
N$10836: IC6140.3(A:O) IC6141.2(A:I1)
N$10837: IC6140.6(B:O) IC6141.1(A:I0)
N$10838: IC6141.3(A:O) IC6142.3(A:I1)
N$10839: IC6142.2(A:I0)
N$10840: IC6142.1(A:O)
N$10841: IC6141.4(B:I0)
N$10842: IC6141.5(B:I1)
N$10843: IC6146.3(A:O) IC6156.2(A:I1)
N$10844: IC6146.2(A:I1) IC6152.3(A:I1)
N$10845: IC6152.1(A:O) IC6156.4(B:I0)
N$10846: IC6152.4(A:I2)
N$10847: IC6144.1(A:O) IC6152.5(A:I3)
N$10848: IC6144.4(B:O) IC6156.5(B:I1)
N$10849: IC6144.2(A:I0) IC6144.5(B:I0) IC6145.2(A:O)
N$10852: IC6144.6(B:I1)
N$10853: IC6144.3(A:I1) IC6156.1(A:I0)
N$10855: IC6145.1(A:I)
N$10856: IC6143.8(D:O)
N$10857: IC6143.9(D:I) IC6155.2(A:I0) IC6166.2(A:I0)
N$10858: IC6166.1(A:O)
N$10875: IC6219.6(B:O)
N$10878: IC6203.6(B:O)
N$10881: IC6145.4(B:O) IC6146.4(B:I0) IC6152.9(B:I0)
N$10882: IC6146.6(B:O) IC6153.1(A:I0)
N$10883: IC6145.3(B:I)
N$10884: IC6152.13(B:O) IC6153.5(B:I1)
N$10885: IC6146.5(B:I1) IC6152.10(B:I1)
N$10886: IC6152.11(B:I2)
N$10887: IC6143.11(E:I)
N$10888: IC6142.11(D:I0) IC6143.10(E:O)
N$10895: IC6142.13(D:O) IC6153.4(B:I0)
N$10896: IC6142.12(D:I1)
N$10897: IC6143.12(F:O) IC6152.12(B:I3)
N$10898: IC6143.13(F:I) IC6153.2(A:I1)
N$10900: IC6144.9(C:I1)
N$10901: IC6144.10(C:O) IC6146.1(A:I0) IC6152.2(A:I0)
N$10902: IC6141.6(B:O) IC6144.8(C:I0)
N$10903: IC6153.3(A:O) IC6154.2(A:I1)
N$10904: IC6153.6(B:O) IC6154.1(A:I0)
N$10905: IC6154.3(A:O) IC6155.3(A:I1)
N$10906: IC6156.3(A:O) IC6165.2(A:I1)
N$10907: IC6156.6(B:O) IC6165.1(A:I0)
N$10908: IC6165.3(A:O) IC6166.3(A:I1)
N$10909: IC6173.4(B:I0)
N$10910: IC6173.5(B:I1)
N$10911: IC6177.3(A:O) IC6182.1(A:I0)
N$10912: IC6177.2(A:I1) IC6178.3(A:I1)
N$10913: IC6178.1(A:O) IC6182.4(B:I0)
N$10914: IC6178.4(A:I2)
N$10915: IC6176.1(A:O) IC6178.5(A:I3)
N$10916: IC6176.4(B:O) IC6182.5(B:I1)
N$10917: IC6176.2(A:I0) IC6176.5(B:I0)
N$10918: IC6176.6(B:I1)
N$10919: IC6176.3(A:I1) IC6182.2(A:I1)
N$10920: IC6181.2(A:I0) IC6184.2(A:I0)
N$10921: IC6184.1(A:O)
N$10925: IC6177.4(B:I0) IC6178.10(B:I1)
N$10926: IC6177.6(B:O) IC6179.1(A:I0)
N$10927: IC6178.13(B:O) IC6179.5(B:I1)
N$10928: IC6177.5(B:I1) IC6178.11(B:I2)
N$10929: IC6178.9(B:I0)
N$10930: IC6174.11(D:I0)
N$10934: IC6181.1(A:O)
N$10935: IC6174.13(D:O) IC6179.4(B:I0)
N$10936: IC6174.12(D:I1)
N$10937: IC6175.12(F:O) IC6178.12(B:I3)
N$10938: IC6175.13(F:I) IC6179.2(A:I1)
N$10940: IC6176.9(C:I1)
N$10941: IC6176.10(C:O) IC6177.1(A:I0) IC6178.2(A:I0)
N$10942: IC6173.6(B:O) IC6176.8(C:I0)
N$10943: IC6179.3(A:O) IC6180.2(A:I1)
N$10944: IC6179.6(B:O) IC6180.1(A:I0)
N$10945: IC6180.3(A:O) IC6181.3(A:I1)
N$10946: IC6182.3(A:O) IC6183.2(A:I1)
N$10947: IC6182.6(B:O) IC6183.1(A:I0)
N$10948: IC6183.3(A:O) IC6184.3(A:I1)
N$10950: IC6156.9(C:I0)
N$10951: IC6156.10(C:I1)
N$10952: IC6195.8(C:O) IC6196.9(C:I0)
N$10953: IC6194.3(A:I1) IC6195.10(C:I1)
N$10954: IC6154.9(C:I0) IC6194.1(A:O)
N$10955: IC6194.4(A:I2)
N$10956: IC6190.1(A:O) IC6194.5(A:I3)
N$10957: IC6153.11(D:O) IC6154.10(C:I1)
N$10958: IC6153.12(D:I0) IC6190.3(A:I1)
N$10959: IC6153.13(D:I1)
N$10960: IC6141.12(D:I0) IC6154.4(B:I0)
N$10961: IC6141.11(D:O)
N$10964: IC6154.12(D:I0) IC6197.3(A:I1)
N$10965: IC6154.11(D:O) IC6165.4(B:I0)
N$10966: IC6197.1(A:O) IC6199.5(B:I1)
N$10967: IC6154.13(D:I1) IC6197.4(A:I2)
N$10968: IC6197.2(A:I0)
N$10969: IC6198.12(D:I0)
N$10973: IC6154.6(B:O)
N$10974: IC6198.11(D:O) IC6199.4(B:I0)
N$10975: IC6198.13(D:I1)
N$10976: IC6165.5(B:I1) IC6197.5(A:I3)
N$10978: IC6165.10(C:I1)
N$10979: IC6165.8(C:O) IC6194.2(A:I0) IC6195.9(C:I0)
N$10980: IC6156.8(C:O) IC6165.9(C:I0)
N$10981: IC6153.10(C:I1) IC6165.6(B:O)
N$10982: IC6153.9(C:I0) IC6199.6(B:O)
N$10983: IC6153.8(C:O) IC6154.5(B:I1)
N$10984: IC6140.13(D:I1) IC6196.8(C:O)
N$10985: IC6140.12(D:I0) IC6154.8(C:O)
N$10986: IC6140.11(D:O) IC6141.13(D:I1)
N$10988: IC6196.10(C:I1)
N$10989: IC6190.2(A:I0)
N$10990: IC6211.8(C:O) IC6212.9(C:I0)
N$10991: IC6210.3(A:I1) IC6211.10(C:I1)
N$10992: IC6203.9(C:I0) IC6210.1(A:O)
N$10993: IC6210.4(A:I2)
N$10994: IC6210.5(A:I3)
N$10995: IC6202.11(D:O) IC6203.10(C:I1)
N$10996: IC6202.12(D:I0)
N$10997: IC6202.13(D:I1)
N$10998: IC6201.12(D:I0) IC6203.4(B:I0)
N$10999: IC6201.11(D:O)
N$11002: IC6203.12(D:I0) IC6213.3(A:I1)
N$11003: IC6203.11(D:O) IC6204.4(B:I0)
N$11004: IC6213.1(A:O) IC6215.5(B:I1)
N$11005: IC6203.13(D:I1) IC6213.4(A:I2)
N$11006: IC6213.2(A:I0)
N$11007: IC6214.12(D:I0)
N$11012: IC6214.11(D:O) IC6215.4(B:I0)
N$11013: IC6214.13(D:I1)
N$11014: IC6204.5(B:I1) IC6213.5(A:I3)
N$11016: IC6156.11(D:O) IC6210.2(A:I0) IC6211.9(C:I0)
N$11017: IC6202.10(C:I1) IC6204.6(B:O)
N$11018: IC6202.9(C:I0) IC6215.6(B:O)
N$11019: IC6202.8(C:O) IC6203.5(B:I1)
N$11020: IC6200.13(D:I1) IC6212.8(C:O)
N$11021: IC6200.12(D:I0) IC6203.8(C:O)
N$11022: IC6200.11(D:O) IC6201.13(D:I1)
N$11024: IC6212.10(C:I1)
N$11025: IC6173.2(A:I1)
N$11026: IC6173.1(A:I0)
N$11027: IC6156.12(D:I0)
N$11028: IC6156.13(D:I1) IC6173.3(A:O)
N$11029: IC6216.12(D:I0) IC6229.12(A:O)
N$11030: IC6225.3(A:I1) IC6229.13(A:I2)
N$11031: IC6219.9(C:I0) IC6225.1(A:O)
N$11032: IC6225.4(A:I2)
N$11033: IC6225.5(A:I3)
N$11034: IC6218.11(D:O) IC6219.10(C:I1)
N$11035: IC6218.12(D:I0)
N$11036: IC6218.13(D:I1)
N$11037: IC6217.12(D:I0) IC6219.4(B:I0)
N$11038: IC6217.11(D:O)
N$11041: IC6226.2(A:I0) IC6229.3(B:I0)
N$11042: IC6218.9(C:I0) IC6229.6(B:O)
N$11043: IC6226.1(A:O) IC6228.4(B:I0)
N$11044: IC6226.3(A:I1) IC6229.4(B:I1)
N$11045: IC6226.5(A:I3)
N$11046: IC6227.12(D:I0)
N$11051: IC6227.11(D:O) IC6228.5(B:I1)
N$11052: IC6227.13(D:I1)
N$11053: IC6226.4(A:I2) IC6229.5(B:I2)
N$11055: IC6179.8(C:O) IC6225.2(A:I0) IC6229.1(A:I0)
N$11056: IC6218.10(C:I1) IC6228.6(B:O)
N$11057: IC6218.8(C:O) IC6219.5(B:I1)
N$11058: IC6216.13(D:I1) IC6219.8(C:O)
N$11059: IC6216.11(D:O) IC6217.13(D:I1)
N$11061: IC6173.10(C:I1)
N$11062: IC6173.9(C:I0)
N$11063: IC6179.9(C:I0)
N$11064: IC6173.8(C:O) IC6179.10(C:I1)
N$11065: IC6229.2(A:I1)
N$11066: IC6230.9(C:I0)
N$11067: IC6230.10(C:I1)
N$11068: IC6231.10(C:I1)
N$11069: IC6231.8(C:O)
N$11070: IC6230.8(C:O) IC6231.9(C:I0)
N$11071: IC6232.11(D:O)
N$11072: IC6233.2(A:I1)
N$11073: IC6233.1(A:I0)
N$11074: IC6232.12(D:I0)
N$11075: IC6232.13(D:I1) IC6233.3(A:O)
N$11076: IC6235.8(C:O)
N$11077: IC6234.10(C:I1) IC6235.10(C:I1)
N$11078: IC6234.9(C:I0) IC6235.9(C:I0)
N$11079: IC6234.8(C:O)
N$11080: IC6155.1(A:O)
VCC: R1339.2 ; also sheet 1,2,3,9,11,12,13,19,20,21,22,23,26
Unconnected: IC6133.4(PWR:V-) IC6133.5(PWR:GND) IC6133.6 IC6133.7 IC6133.8 IC6133.9 IC6133.10 IC6133.11 IC6133.12(PWR:VCC) IC6133.13(PWR:V+) IC6133.14 IC6133.15 IC6133.16 IC6136.4(PWR:V-) IC6136.5(PWR:GND) IC6136.6 IC6136.7 IC6136.8 IC6136.9 IC6136.10 IC6136.11 IC6136.12(PWR:VCC) IC6136.13(PWR:V+) IC6136.14 IC6136.15 IC6136.16 IC6137.4(PWR:V-) IC6137.5(PWR:GND) IC6137.6 IC6137.7 IC6137.8 IC6137.9 IC6137.10 IC6137.11 IC6137.12(PWR:VCC) IC6137.13(PWR:V+) IC6137.14 IC6137.15 IC6137.16 IC6138.4(PWR:V-) IC6138.5(PWR:GND) IC6138.6 IC6138.7 IC6138.8 IC6138.9 IC6138.10 IC6138.11 IC6138.12(PWR:VCC) IC6138.13(PWR:V+) IC6138.14 IC6138.15 IC6138.16 IC6139.4(PWR:V-) IC6139.5(PWR:GND) IC6139.6 IC6139.7 IC6139.8 IC6139.9 IC6139.10 IC6139.11 IC6139.12(PWR:VCC) IC6139.13(PWR:V+) IC6139.14 IC6139.15 IC6139.16 IC6140.8(C:O) IC6140.9(C:I0) IC6140.10(C:I1) IC6141.8(C:O) IC6141.9(C:I0) IC6141.10(C:I1) IC6142.4(B:O) IC6142.5(B:I0) IC6142.6(B:I1) IC6142.8(C:I0) IC6142.9(C:I1) IC6142.10(C:O) IC6143.1(A:I) IC6143.2(A:O) IC6143.3(B:I) IC6143.4(B:O) IC6143.5(C:I) IC6143.6(C:O) IC6144.11(D:I0) IC6144.12(D:I1) IC6144.13(D:O) IC6145.5(C:I) IC6145.6(C:O) IC6145.8(D:O) IC6145.9(D:I) IC6145.10(E:O) IC6145.11(E:I) IC6145.12(F:O) IC6145.13(F:I) IC6146.8(C:O) IC6146.9(C:I0) IC6146.10(C:I1) IC6146.11(D:O) IC6146.12(D:I0) IC6146.13(D:I1) IC6155.4(B:O) IC6155.5(B:I0) IC6155.6(B:I1) IC6155.8(C:I0) IC6155.9(C:I1) IC6155.10(C:O) IC6155.11(D:I0) IC6155.12(D:I1) IC6155.13(D:O) IC6165.11(D:O) IC6165.12(D:I0) IC6165.13(D:I1) IC6166.4(B:O) IC6166.5(B:I0) IC6166.6(B:I1) IC6166.8(C:I0) IC6166.9(C:I1) IC6166.10(C:O) IC6166.11(D:I0) IC6166.12(D:I1) IC6166.13(D:O) IC6173.11(D:O) IC6173.12(D:I0) IC6173.13(D:I1) IC6174.1(A:O) IC6174.2(A:I0) IC6174.3(A:I1) IC6174.4(B:O) IC6174.5(B:I0) IC6174.6(B:I1) IC6174.8(C:I0) IC6174.9(C:I1) IC6174.10(C:O) IC6175.1(A:I) IC6175.2(A:O) IC6175.3(B:I) IC6175.4(B:O) IC6175.5(C:I) IC6175.6(C:O) IC6175.8(D:O) IC6175.9(D:I) IC6175.10(E:O) IC6175.11(E:I) IC6176.11(D:I0) IC6176.12(D:I1) IC6176.13(D:O) IC6177.8(C:O) IC6177.9(C:I0) IC6177.10(C:I1) IC6177.11(D:O) IC6177.12(D:I0) IC6177.13(D:I1) IC6179.11(D:O) IC6179.12(D:I0) IC6179.13(D:I1) IC6180.4(B:I0) IC6180.5(B:I1) IC6180.6(B:O) IC6180.8(C:O) IC6180.9(C:I0) IC6180.10(C:I1) IC6180.11(D:O) IC6180.12(D:I0) IC6180.13(D:I1) IC6181.4(B:O) IC6181.5(B:I0) IC6181.6(B:I1) IC6181.8(C:I0) IC6181.9(C:I1) IC6181.10(C:O) IC6181.11(D:I0) IC6181.12(D:I1) IC6181.13(D:O) IC6182.8(C:O) IC6182.9(C:I0) IC6182.10(C:I1) IC6182.11(D:O) IC6182.12(D:I0) IC6182.13(D:I1) IC6183.4(B:I0) IC6183.5(B:I1) IC6183.6(B:O) IC6183.8(C:O) IC6183.9(C:I0) IC6183.10(C:I1) IC6183.11(D:O) IC6183.12(D:I0) IC6183.13(D:I1) IC6184.4(B:O) IC6184.5(B:I0) IC6184.6(B:I1) IC6184.8(C:I0) IC6184.9(C:I1) IC6184.10(C:O) IC6184.11(D:I0) IC6184.12(D:I1) IC6184.13(D:O) IC6190.4(B:O) IC6190.5(B:I0) IC6190.6(B:I1) IC6190.8(C:I0) IC6190.9(C:I1) IC6190.10(C:O) IC6190.11(D:I0) IC6190.12(D:I1) IC6190.13(D:O) IC6194.9(B:I0) IC6194.10(B:I1) IC6194.11(B:I2) IC6194.12(B:I3) IC6194.13(B:O) IC6195.1(A:I0) IC6195.2(A:I1) IC6195.3(A:O) IC6195.4(B:I0) IC6195.5(B:I1) IC6195.6(B:O) IC6195.11(D:O) IC6195.12(D:I0) IC6195.13(D:I1) IC6196.1(A:I0) IC6196.2(A:I1) IC6196.3(A:O) IC6196.4(B:I0) IC6196.5(B:I1) IC6196.6(B:O) IC6196.11(D:O) IC6196.12(D:I0) IC6196.13(D:I1) IC6197.9(B:I0) IC6197.10(B:I1) IC6197.11(B:I2) IC6197.12(B:I3) IC6197.13(B:O) IC6198.1(A:I0) IC6198.2(A:I1) IC6198.3(A:O) IC6198.4(B:I0) IC6198.5(B:I1) IC6198.6(B:O) IC6198.8(C:O) IC6198.9(C:I0) IC6198.10(C:I1) IC6199.1(A:I0) IC6199.2(A:I1) IC6199.3(A:O) IC6199.8(C:O) IC6199.9(C:I0) IC6199.10(C:I1) IC6199.11(D:O) IC6199.12(D:I0) IC6199.13(D:I1) IC6200.1(A:I0) IC6200.2(A:I1) IC6200.3(A:O) IC6200.4(B:I0) IC6200.5(B:I1) IC6200.6(B:O) IC6200.8(C:O) IC6200.9(C:I0) IC6200.10(C:I1) IC6201.1(A:I0) IC6201.2(A:I1) IC6201.3(A:O) IC6201.4(B:I0) IC6201.5(B:I1) IC6201.6(B:O) IC6201.8(C:O) IC6201.9(C:I0) IC6201.10(C:I1) IC6202.1(A:I0) IC6202.2(A:I1) IC6202.3(A:O) IC6202.4(B:I0) IC6202.5(B:I1) IC6202.6(B:O) IC6203.1(A:I0) IC6203.2(A:I1) IC6203.3(A:O) IC6204.1(A:I0) IC6204.2(A:I1) IC6204.3(A:O) IC6204.8(C:O) IC6204.9(C:I0) IC6204.10(C:I1) IC6204.11(D:O) IC6204.12(D:I0) IC6204.13(D:I1) IC6210.9(B:I0) IC6210.10(B:I1) IC6210.11(B:I2) IC6210.12(B:I3) IC6210.13(B:O) IC6211.1(A:I0) IC6211.2(A:I1) IC6211.3(A:O) IC6211.4(B:I0) IC6211.5(B:I1) IC6211.6(B:O) IC6211.11(D:O) IC6211.12(D:I0) IC6211.13(D:I1) IC6212.1(A:I0) IC6212.2(A:I1) IC6212.3(A:O) IC6212.4(B:I0) IC6212.5(B:I1) IC6212.6(B:O) IC6212.11(D:O) IC6212.12(D:I0) IC6212.13(D:I1) IC6213.9(B:I0) IC6213.10(B:I1) IC6213.11(B:I2) IC6213.12(B:I3) IC6213.13(B:O) IC6214.1(A:I0) IC6214.2(A:I1) IC6214.3(A:O) IC6214.4(B:I0) IC6214.5(B:I1) IC6214.6(B:O) IC6214.8(C:O) IC6214.9(C:I0) IC6214.10(C:I1) IC6215.1(A:I0) IC6215.2(A:I1) IC6215.3(A:O) IC6215.8(C:O) IC6215.9(C:I0) IC6215.10(C:I1) IC6215.11(D:O) IC6215.12(D:I0) IC6215.13(D:I1) IC6216.1(A:I0) IC6216.2(A:I1) IC6216.3(A:O) IC6216.4(B:I0) IC6216.5(B:I1) IC6216.6(B:O) IC6216.8(C:O) IC6216.9(C:I0) IC6216.10(C:I1) IC6217.1(A:I0) IC6217.2(A:I1) IC6217.3(A:O) IC6217.4(B:I0) IC6217.5(B:I1) IC6217.6(B:O) IC6217.8(C:O) IC6217.9(C:I0) IC6217.10(C:I1) IC6218.1(A:I0) IC6218.2(A:I1) IC6218.3(A:O) IC6218.4(B:I0) IC6218.5(B:I1) IC6218.6(B:O) IC6219.1(A:I0) IC6219.2(A:I1) IC6219.3(A:O) IC6219.11(D:O) IC6219.12(D:I0) IC6219.13(D:I1) IC6225.9(B:I0) IC6225.10(B:I1) IC6225.11(B:I2) IC6225.12(B:I3) IC6225.13(B:O) IC6226.9(B:I0) IC6226.10(B:I1) IC6226.11(B:I2) IC6226.12(B:I3) IC6226.13(B:O) IC6227.1(A:I0) IC6227.2(A:I1) IC6227.3(A:O) IC6227.4(B:I0) IC6227.5(B:I1) IC6227.6(B:O) IC6227.8(C:O) IC6227.9(C:I0) IC6227.10(C:I1) IC6228.1(A:I0) IC6228.2(A:I1) IC6228.3(A:O) IC6228.8(C:O) IC6228.9(C:I0) IC6228.10(C:I1) IC6228.11(D:O) IC6228.12(D:I0) IC6228.13(D:I1) IC6229.8(C:O) IC6229.9(C:I0) IC6229.10(C:I1) IC6229.11(C:I2) IC6230.1(A:I0) IC6230.2(A:I1) IC6230.3(A:O) IC6230.4(B:I0) IC6230.5(B:I1) IC6230.6(B:O) IC6230.11(D:O) IC6230.12(D:I0) IC6230.13(D:I1) IC6231.1(A:I0) IC6231.2(A:I1) IC6231.3(A:O) IC6231.4(B:I0) IC6231.5(B:I1) IC6231.6(B:O) IC6231.11(D:O) IC6231.12(D:I0) IC6231.13(D:I1) IC6232.1(A:I0) IC6232.2(A:I1) IC6232.3(A:O) IC6232.4(B:I0) IC6232.5(B:I1) IC6232.6(B:O) IC6232.8(C:O) IC6232.9(C:I0) IC6232.10(C:I1) IC6233.4(B:I0) IC6233.5(B:I1) IC6233.6(B:O) IC6233.8(C:O) IC6233.9(C:I0) IC6233.10(C:I1) IC6233.11(D:O) IC6233.12(D:I0) IC6233.13(D:I1) IC6234.1(A:I0) IC6234.2(A:I1) IC6234.3(A:O) IC6234.4(B:I0) IC6234.5(B:I1) IC6234.6(B:O) IC6234.11(D:O) IC6234.12(D:I0) IC6234.13(D:I1) IC6235.1(A:I0) IC6235.2(A:I1) IC6235.3(A:O) IC6235.4(B:I0) IC6235.5(B:I1) IC6235.6(B:O) IC6235.11(D:O) IC6235.12(D:I0) IC6235.13(D:I1)

### Buses
B$12

### Notes on the sheet
- AND/NOR
- nand0 | and0
- ACIN
- /ACIN | DAA
- or0
- nor0
- and1
- xor1
- and1 | xor2 | DC3
- xor1
- and2
- nand2
- and2
- xor3 | xor3
- or2
- nor3
- /DAA | DAA | and6
- xor7
- xor5
- carry4
- DC3
- and5
- DC7
- xor6
- carry4
- /carry4
- and5
- and0
- xor5 | cin1'
- ACIN
- xnor6 | or0
- DAA
- or2
- DC7 | and1 | DC3
- xor1
- xor2
- and2
- and6 | xor3
- nand6
- carry4
- XOR7
- and5
- xor6
- DC7
- AND/NOR
- nand0
- XOR5
- /ACIN
- and6
- xor7
- nor0
- /DAA
- and1
- xor1
- DC3
- side note: multi_function gate
- and2
- xor3
- nor2
- Q
- E
- Q
- and6 | C | E | D
- xor7
- C
- xor5
- carry4
- B
- and5 | D
- A | B | A
- DC7
- xnor6
- side note: 
  possible implementations
  for a carry chain
- and0
- ALU_inputs
- carry chain
  version 1
- carry chain
  version 2
- ACIN
- DAA
- or0 | ALU_A0
- OR0
- and1
- =Cin1' | =Cin1'
- xor1
- ALU Bit0 | AND0
- DC3 | ALU_B0 | U | V | W | X
- Ci0 | ALU_A0 | ALU_B0 | AND0 | OR0
- 0 | 0 | 0 | 0 | 0 | 0 | 0 | 0 | 0
- nor2
- 0 | 0 | 1 | 0 | 1 | 0 | 0 | 0 | 0
- AND0 | U
- V
- and2 | Ci0
- 0 | 1 | 0 | 0 | 1 | 0 | 0 | 0 | 0
- xor3
- OR0
- 0 | 1 | 1 | 1 | 1 | 1 | 1 | 0 | 1
- carry chain
  version 1
- or2
- 1 | 0 | 0 | 0 | 0 | 1 | 0 | 0 | 0
- and6 | AND0
- 1 | 0 | 1 | 0 | 1 | 1 | 1 | 1 | 1
- xor7 | X
- Ci0
- 1 | 1 | 0 | 0 | 1 | 1 | 1 | 1 | 1
- xor5 | OR0 | W
- carry chain
  version 2
- 1 | 1 | 1 | 1 | 1 | 1 | 1 | 1 | 1
- carry4
- and5
- DC7
- xor6
- https://github.com/emu-russia/breaks/blob/master/BreakingNESWiki_DeepL/6502/alu.md
  3:https://github.com/emu-russia/breaks/blob/master/BreakingNESWiki/imgstore/logisim/alu_bcd_carry_logisim.jpg

## Sheet 5 of 29
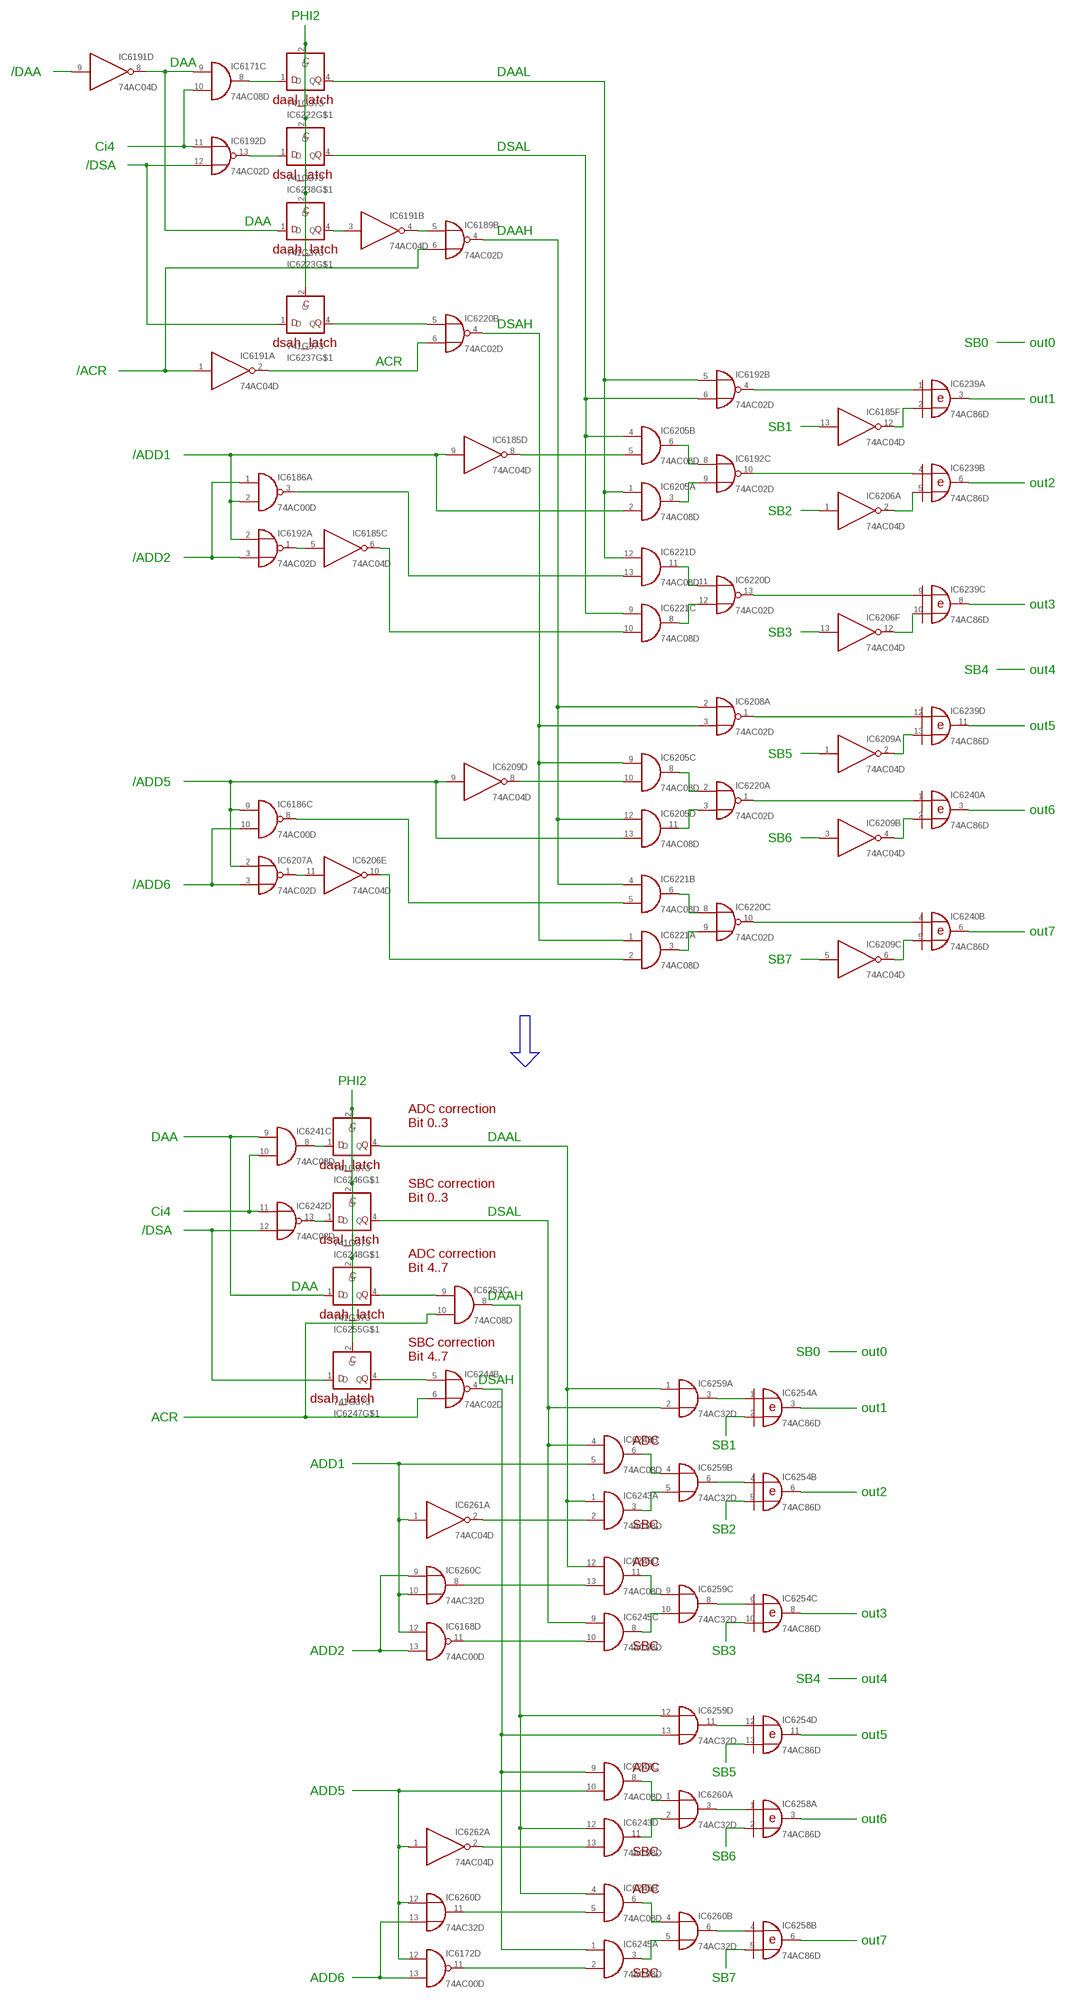
[diagram p5: schematic, sheet 5]

### Parts
IC6168  74AC00D  [SO14]
IC6171  74AC08D  [SO14]
IC6172  74AC00D  [SO14]
IC6185  74AC04D  [SO14]
IC6186  74AC00D  [SO14]
IC6189  74AC02D  [SO14]
IC6191  74AC04D  [SO14]
IC6192  74AC02D  [SO14]
IC6205  74AC08D  [SO14]
IC6206  74AC04D  [SO14]
IC6207  74AC02D  [SO14]
IC6208  74AC02D  [SO14]
IC6209  74AC04D  [SO14]
IC6220  74AC02D  [SO14]
IC6221  74AC08D  [SO14]
IC6222  741G373  [DBV-R-PDSO-G5]
IC6223  741G373  [DBV-R-PDSO-G5]
IC6237  741G373  [DBV-R-PDSO-G5]
IC6238  741G373  [DBV-R-PDSO-G5]
IC6239  74AC86D  [SO14]
IC6240  74AC86D  [SO14]
IC6241  74AC08D  [SO14]
IC6242  74AC02D  [SO14]
IC6243  74AC08D  [SO14]
IC6244  74AC02D  [SO14]
IC6245  74AC08D  [SO14]
IC6246  741G373  [DBV-R-PDSO-G5]
IC6247  741G373  [DBV-R-PDSO-G5]
IC6248  741G373  [DBV-R-PDSO-G5]
IC6253  74AC08D  [SO14]
IC6254  74AC86D  [SO14]
IC6255  741G373  [DBV-R-PDSO-G5]
IC6258  74AC86D  [SO14]
IC6259  74AC32D  [SO14]
IC6260  74AC32D  [SO14]
IC6261  74AC04D  [SO14]
IC6262  74AC04D  [SO14]

### Nets
N$10879: IC6191.2(A:O) IC6220.6(B:I1)
N$10889: IC6241.9(C:I0) IC6255.1(D)
N$10890: IC6186.3(A:O) IC6221.13(D:I1)
N$10891: IC6185.9(D:I) IC6186.2(A:I1) IC6192.2(A:I0) IC6205.2(A:I1)
N$10892: IC6186.1(A:I0) IC6192.3(A:I1)
N$10893: IC6185.5(C:I) IC6192.1(A:O)
N$10899: IC6185.6(C:O) IC6221.10(C:I1)
N$10922: IC6192.6(B:I1) IC6205.4(B:I0) IC6221.9(C:I0) IC6238.4(Q)
N$10923: IC6185.8(D:O) IC6205.5(B:I1)
N$10924: IC6239.3(A:O)
N$10932: IC6185.13(F:I)
N$10933: IC6192.10(C:O) IC6239.4(B:I0)
N$10939: IC6206.1(A:I)
N$10949: IC6192.5(B:I0) IC6205.1(A:I0) IC6221.12(D:I0) IC6222.4(Q)
N$10962: IC6171.8(C:O) IC6222.1(D)
N$10970: IC6171.10(C:I1) IC6192.11(D:I0)
N$10971: IC6192.12(D:I1) IC6237.1(D)
N$10972: IC6192.13(D:O) IC6238.1(D)
N$10977: IC6220.13(D:O) IC6239.9(C:I0)
N$10987: IC6206.12(F:O) IC6239.10(C:I1)
N$11000: IC6206.13(F:I)
N$11008: IC6222.2(C) IC6223.2(C) IC6237.2(C) IC6238.2(C)
N$11009: IC6220.5(B:I0) IC6237.4(Q)
N$11010: IC6171.9(C:I0) IC6191.8(D:O) IC6223.1(D)
N$11011: IC6191.9(D:I)
N$11015: IC6205.9(C:I0) IC6208.3(A:I1) IC6220.4(B:O) IC6221.1(A:I0)
N$11039: IC6191.3(B:I) IC6223.4(Q)
N$11040: IC6189.5(B:I0) IC6191.4(B:O)
N$11049: IC6209.2(A:O) IC6239.13(D:I1)
N$11050: IC6209.1(A:I)
N$11054: IC6208.1(A:O) IC6239.12(D:I0)
N$11081: IC6186.9(C:I0) IC6205.13(D:I1) IC6207.2(A:I0) IC6209.9(D:I)
N$11082: IC6186.8(C:O) IC6221.5(B:I1)
N$11083: IC6206.11(E:I) IC6207.1(A:O)
N$11086: IC6189.6(B:I1) IC6191.1(A:I)
N$11090: IC6186.10(C:I1) IC6207.3(A:I1)
N$11092: IC6209.4(B:O) IC6240.2(A:I1)
N$11093: IC6209.3(B:I)
N$11094: IC6189.4(B:O) IC6205.12(D:I0) IC6208.2(A:I0) IC6221.4(B:I0)
N$11095: IC6220.1(A:O) IC6240.1(A:I0)
N$11096: IC6205.10(C:I1) IC6209.8(D:O)
N$11097: IC6209.6(C:O) IC6240.5(B:I1)
N$11098: IC6209.5(C:I)
N$11099: IC6220.10(C:O) IC6240.4(B:I0)
N$11100: IC6206.10(E:O) IC6221.2(A:I1)
N$11103: IC6239.6(B:O)
N$11104: IC6239.8(C:O)
N$11105: IC6239.11(D:O)
N$11106: IC6240.3(A:O)
N$11107: IC6240.6(B:O)
N$11108: IC6192.9(C:I1) IC6205.3(A:O)
N$11109: IC6192.8(C:I0) IC6205.6(B:O)
N$11110: IC6205.8(C:O) IC6220.2(A:I0)
N$11111: IC6205.11(D:O) IC6220.3(A:I1)
N$11112: IC6220.9(C:I1) IC6221.3(A:O)
N$11113: IC6220.8(C:I0) IC6221.6(B:O)
N$11114: IC6220.12(D:I1) IC6221.8(C:O)
N$11116: IC6220.11(D:I0) IC6221.11(D:O)
N$11120: IC6192.4(B:O) IC6239.1(A:I0)
N$11121: IC6185.12(F:O) IC6239.2(A:I1)
N$11122: IC6206.2(A:O) IC6239.5(B:I1)
N$11123: IC6245.13(D:I1) IC6260.8(C:O)
N$11124: IC6243.2(A:I1) IC6261.2(A:O)
N$11125: IC6168.13(D:I1) IC6260.9(C:I0)
N$11130: IC6168.11(D:O) IC6245.10(C:I1)
N$11131: IC6243.4(B:I0) IC6245.9(C:I0) IC6248.4(Q) IC6259.2(A:I1)
N$11132: IC6254.3(A:O)
N$11133: IC6254.4(B:I0) IC6259.6(B:O)
N$11135: IC6243.1(A:I0) IC6245.12(D:I0) IC6246.4(Q) IC6259.1(A:I0)
N$11136: IC6241.8(C:O) IC6246.1(D)
N$11138: IC6241.10(C:I1) IC6242.11(D:I0)
N$11139: IC6242.12(D:I1) IC6247.1(D)
N$11140: IC6242.13(D:O) IC6248.1(D)
N$11141: IC6254.9(C:I0) IC6259.8(C:O)
N$11142: IC6254.10(C:I1)
N$11143: IC6244.6(B:I1) IC6253.10(C:I1)
N$11145: IC6246.2(C) IC6247.2(C) IC6248.2(C) IC6255.2(C)
N$11146: IC6244.5(B:I0) IC6247.4(Q)
N$11147: IC6243.9(C:I0) IC6244.4(B:O) IC6245.1(A:I0) IC6259.13(D:I1)
N$11148: IC6243.12(D:I0) IC6245.4(B:I0) IC6253.8(C:O) IC6259.12(D:I0)
N$11149: IC6254.13(D:I1)
N$11150: IC6254.12(D:I0) IC6259.11(D:O)
N$11151: IC6172.12(D:I0) IC6243.10(C:I1) IC6260.12(D:I0) IC6262.1(A:I)
N$11152: IC6245.5(B:I1) IC6260.11(D:O)
N$11153: IC6172.13(D:I1) IC6260.13(D:I1)
N$11154: IC6258.2(A:I1)
N$11155: IC6258.1(A:I0) IC6260.3(A:O)
N$11156: IC6258.5(B:I1)
N$11159: IC6258.4(B:I0) IC6260.6(B:O)
N$11160: IC6172.11(D:O) IC6245.2(A:I1)
N$11163: IC6254.6(B:O)
N$11164: IC6254.8(C:O)
N$11169: IC6254.11(D:O)
N$11170: IC6258.3(A:O)
N$11171: IC6258.6(B:O)
N$11173: IC6243.3(A:O) IC6259.5(B:I1)
N$11174: IC6243.6(B:O) IC6259.4(B:I0)
N$11175: IC6243.8(C:O) IC6260.1(A:I0)
N$11176: IC6243.11(D:O) IC6260.2(A:I1)
N$11177: IC6245.3(A:O) IC6260.5(B:I1)
N$11178: IC6245.6(B:O) IC6260.4(B:I0)
N$11179: IC6245.8(C:O) IC6259.10(C:I1)
N$11180: IC6245.11(D:O) IC6259.9(C:I0)
N$11181: IC6254.1(A:I0) IC6259.3(A:O)
N$11182: IC6253.9(C:I0) IC6255.4(Q)
N$11183: IC6254.2(A:I1)
N$11184: IC6254.5(B:I1)
N$11185: IC6168.12(D:I0) IC6243.5(B:I1) IC6260.10(C:I1) IC6261.1(A:I)
N$11186: IC6243.13(D:I1) IC6262.2(A:O)
Unconnected: IC6168.1(A:I0) IC6168.2(A:I1) IC6168.3(A:O) IC6168.4(B:I0) IC6168.5(B:I1) IC6168.6(B:O) IC6168.8(C:O) IC6168.9(C:I0) IC6168.10(C:I1) IC6171.1(A:I0) IC6171.2(A:I1) IC6171.3(A:O) IC6171.4(B:I0) IC6171.5(B:I1) IC6171.6(B:O) IC6171.11(D:O) IC6171.12(D:I0) IC6171.13(D:I1) IC6172.1(A:I0) IC6172.2(A:I1) IC6172.3(A:O) IC6172.4(B:I0) IC6172.5(B:I1) IC6172.6(B:O) IC6172.8(C:O) IC6172.9(C:I0) IC6172.10(C:I1) IC6185.1(A:I) IC6185.2(A:O) IC6185.3(B:I) IC6185.4(B:O) IC6185.10(E:O) IC6185.11(E:I) IC6186.4(B:I0) IC6186.5(B:I1) IC6186.6(B:O) IC6186.11(D:O) IC6186.12(D:I0) IC6186.13(D:I1) IC6189.1(A:O) IC6189.2(A:I0) IC6189.3(A:I1) IC6189.8(C:I0) IC6189.9(C:I1) IC6189.10(C:O) IC6189.11(D:I0) IC6189.12(D:I1) IC6189.13(D:O) IC6191.5(C:I) IC6191.6(C:O) IC6191.10(E:O) IC6191.11(E:I) IC6191.12(F:O) IC6191.13(F:I) IC6206.3(B:I) IC6206.4(B:O) IC6206.5(C:I) IC6206.6(C:O) IC6206.8(D:O) IC6206.9(D:I) IC6207.4(B:O) IC6207.5(B:I0) IC6207.6(B:I1) IC6207.8(C:I0) IC6207.9(C:I1) IC6207.10(C:O) IC6207.11(D:I0) IC6207.12(D:I1) IC6207.13(D:O) IC6208.4(B:O) IC6208.5(B:I0) IC6208.6(B:I1) IC6208.8(C:I0) IC6208.9(C:I1) IC6208.10(C:O) IC6208.11(D:I0) IC6208.12(D:I1) IC6208.13(D:O) IC6209.10(E:O) IC6209.11(E:I) IC6209.12(F:O) IC6209.13(F:I) IC6240.8(C:O) IC6240.9(C:I0) IC6240.10(C:I1) IC6240.11(D:O) IC6240.12(D:I0) IC6240.13(D:I1) IC6241.1(A:I0) IC6241.2(A:I1) IC6241.3(A:O) IC6241.4(B:I0) IC6241.5(B:I1) IC6241.6(B:O) IC6241.11(D:O) IC6241.12(D:I0) IC6241.13(D:I1) IC6242.1(A:O) IC6242.2(A:I0) IC6242.3(A:I1) IC6242.4(B:O) IC6242.5(B:I0) IC6242.6(B:I1) IC6242.8(C:I0) IC6242.9(C:I1) IC6242.10(C:O) IC6244.1(A:O) IC6244.2(A:I0) IC6244.3(A:I1) IC6244.8(C:I0) IC6244.9(C:I1) IC6244.10(C:O) IC6244.11(D:I0) IC6244.12(D:I1) IC6244.13(D:O) IC6253.1(A:I0) IC6253.2(A:I1) IC6253.3(A:O) IC6253.4(B:I0) IC6253.5(B:I1) IC6253.6(B:O) IC6253.11(D:O) IC6253.12(D:I0) IC6253.13(D:I1) IC6258.8(C:O) IC6258.9(C:I0) IC6258.10(C:I1) IC6258.11(D:O) IC6258.12(D:I0) IC6258.13(D:I1) IC6261.3(B:I) IC6261.4(B:O) IC6261.5(C:I) IC6261.6(C:O) IC6261.8(D:O) IC6261.9(D:I) IC6261.10(E:O) IC6261.11(E:I) IC6261.12(F:O) IC6261.13(F:I) IC6262.3(B:I) IC6262.4(B:O) IC6262.5(C:I) IC6262.6(C:O) IC6262.8(D:O) IC6262.9(D:I) IC6262.10(E:O) IC6262.11(E:I) IC6262.12(F:O) IC6262.13(F:I)

### Buses
B$12

### Notes on the sheet
- PHI2
- DAA
- /DAA | DAAL
- daal_latch
- Ci4 | DSAL
- /DSA
- dsal_latch
- DAA
- DAAH
- daah_latch
- DSAH
- dsah_latch | SB0 | out0
- ACR
- /ACR
- out1
- SB1
- /ADD1
- out2
- SB2
- /ADD2
- out3
- SB3
- SB4 | out4
- out5
- SB5
- /ADD5
- out6
- SB6
- /ADD6
- out7
- SB7
- PHI2
- ADC correction
  Bit 0..3
- DAA | DAAL
- daal_latch
- SBC correction
  Bit 0..3
- Ci4 | DSAL
- /DSA
- dsal_latch
- ADC correction
  Bit 4..7
- DAA
- DAAH
- daah_latch
- SB0 | out0
- SBC correction
  Bit 4..7
- DSAH
- dsah_latch
- out1
- ACR
- ADC
- SB1
- ADD1
- out2
- SBC
- SB2
- ADC
- out3
- SBC
- ADD2 | SB3
- SB4 | out4
- out5
- ADC
- SB5
- ADD5
- out6
- SBC
- SB6
- ADC
- out7
- SBC
- ADD6 | SB7
- https://github.com/emu-russia/breaks/blob/master/BreakingNESWiki_DeepL/6502/alu.md
  4:https://github.com/emu-russia/breaks/blob/master/BreakingNESWiki/imgstore/logisim/alu_bcd_logisim.jpg

## Sheet 6 of 29
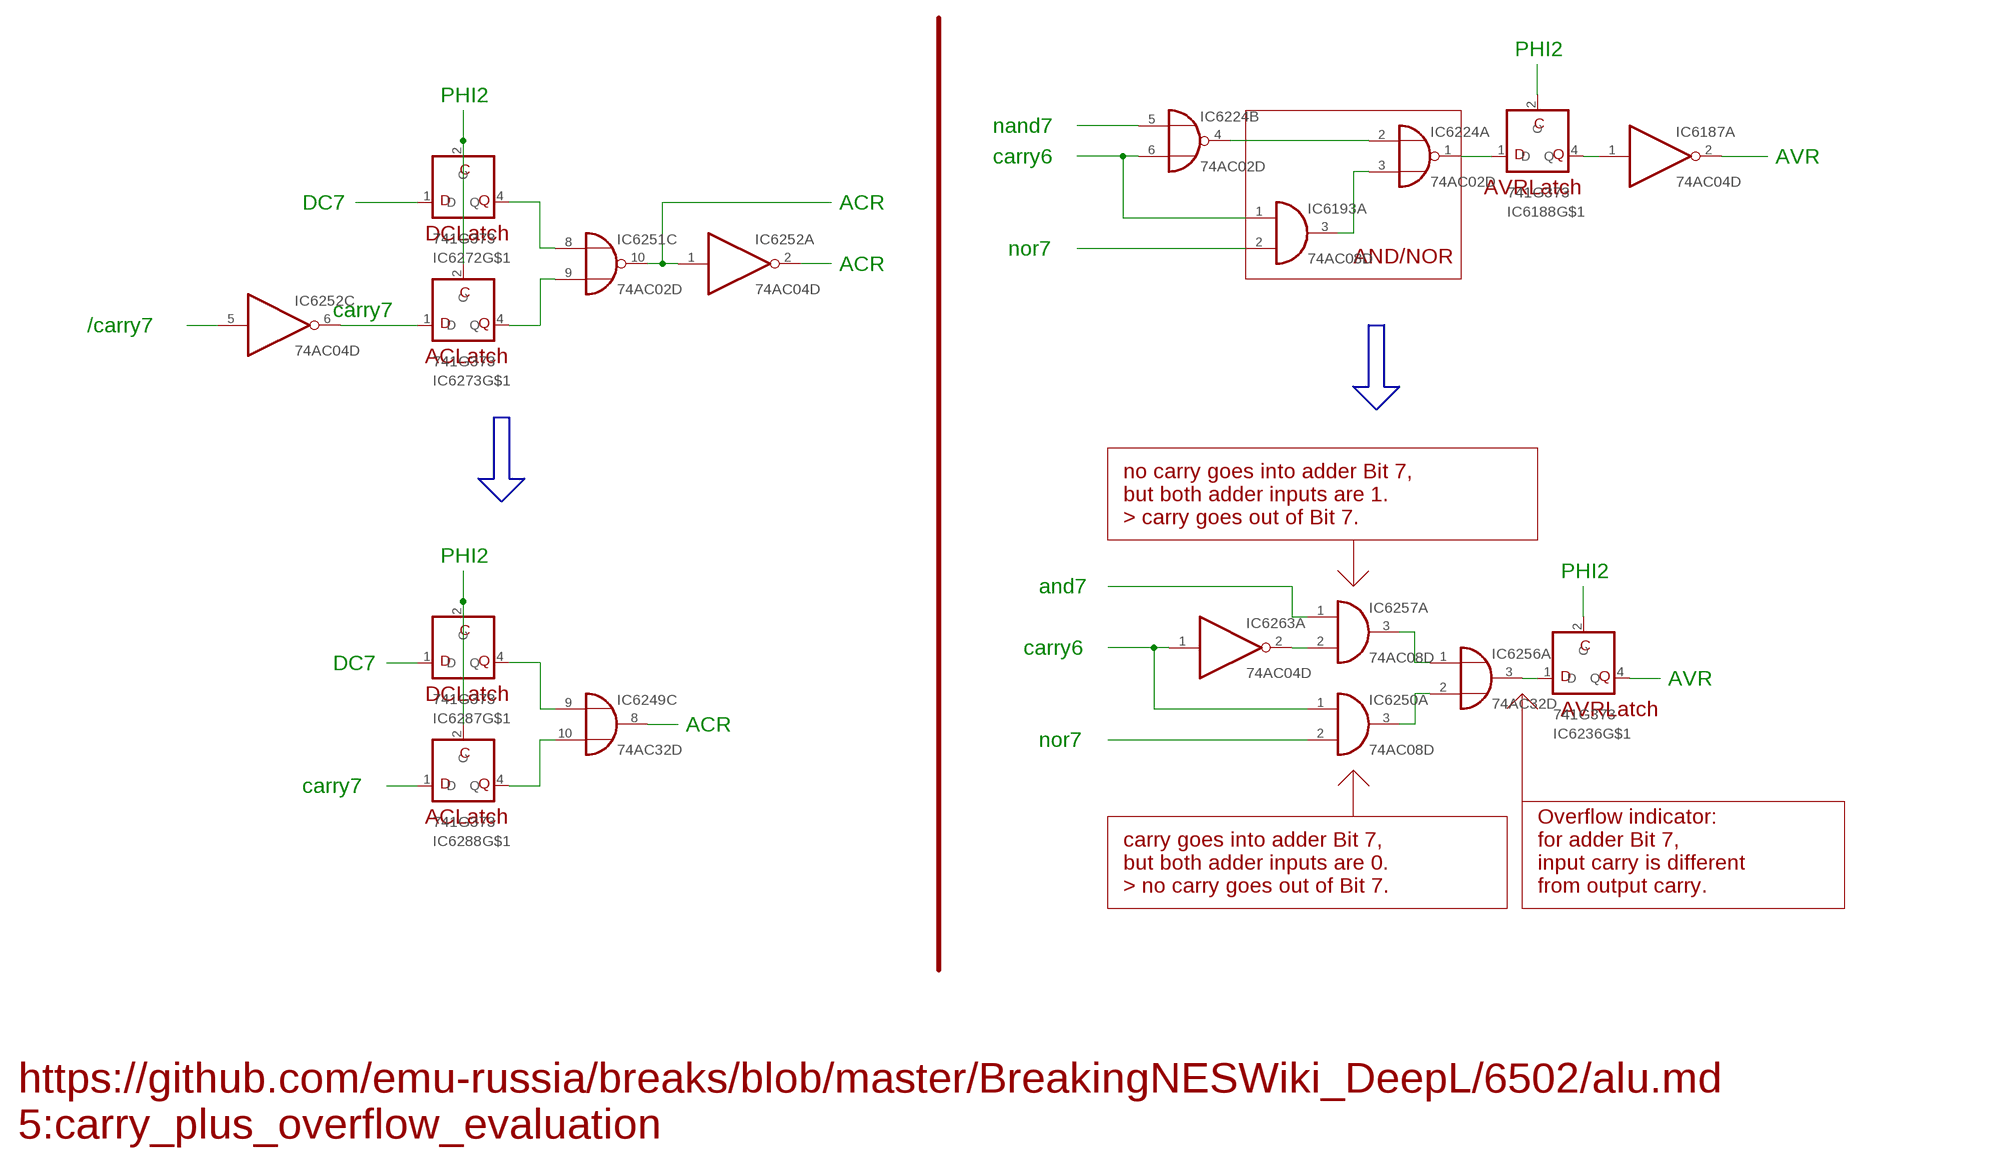
[diagram p6: schematic, sheet 6]

### Parts
IC6187  74AC04D  [SO14]
IC6188  741G373  [DBV-R-PDSO-G5]
IC6193  74AC08D  [SO14]
IC6224  74AC02D  [SO14]
IC6236  741G373  [DBV-R-PDSO-G5]
IC6249  74AC32D  [SO14]
IC6250  74AC08D  [SO14]
IC6251  74AC02D  [SO14]
IC6252  74AC04D  [SO14]
IC6256  74AC32D  [SO14]
IC6257  74AC08D  [SO14]
IC6263  74AC04D  [SO14]
IC6272  741G373  [DBV-R-PDSO-G5]
IC6273  741G373  [DBV-R-PDSO-G5]
IC6287  741G373  [DBV-R-PDSO-G5]
IC6288  741G373  [DBV-R-PDSO-G5]

### Nets
N$10880: IC6224.2(A:I0) IC6224.4(B:O)
N$10894: IC6224.5(B:I0)
N$10931: IC6193.1(A:I0) IC6224.6(B:I1)
N$10963: IC6193.2(A:I1)
N$11001: IC6188.1(D) IC6224.1(A:O)
N$11023: IC6188.2(C)
N$11047: IC6187.1(A:I) IC6188.4(Q)
N$11048: IC6187.2(A:O)
N$11060: IC6193.3(A:O) IC6224.3(A:I1)
N$11084: IC6256.1(A:I0) IC6257.3(A:O)
N$11085: IC6257.1(A:I0)
N$11087: IC6250.1(A:I0) IC6263.1(A:I)
N$11088: IC6250.2(A:I1)
N$11089: IC6236.1(D) IC6256.3(A:O)
N$11091: IC6236.2(C)
N$11115: IC6236.4(Q)
N$11117: IC6250.3(A:O) IC6256.2(A:I1)
N$11118: IC6257.2(A:I1) IC6263.2(A:O)
N$11168: IC6272.2(C) IC6273.2(C)
N$11188: IC6252.2(A:O)
N$11197: IC6251.8(C:I0) IC6272.4(Q)
N$11198: IC6251.9(C:I1) IC6273.4(Q)
N$11199: IC6251.10(C:O) IC6252.1(A:I)
N$11200: IC6252.6(C:O) IC6273.1(D)
N$11201: IC6252.5(C:I)
N$11202: IC6272.1(D)
N$11230: IC6287.2(C) IC6288.2(C)
N$11232: IC6249.8(C:O)
N$11239: IC6249.9(C:I0) IC6287.4(Q)
N$11240: IC6249.10(C:I1) IC6288.4(Q)
N$11241: IC6288.1(D)
N$11242: IC6287.1(D)
Unconnected: IC6187.3(B:I) IC6187.4(B:O) IC6187.5(C:I) IC6187.6(C:O) IC6187.8(D:O) IC6187.9(D:I) IC6187.10(E:O) IC6187.11(E:I) IC6187.12(F:O) IC6187.13(F:I) IC6193.4(B:I0) IC6193.5(B:I1) IC6193.6(B:O) IC6193.8(C:O) IC6193.9(C:I0) IC6193.10(C:I1) IC6193.11(D:O) IC6193.12(D:I0) IC6193.13(D:I1) IC6224.8(C:I0) IC6224.9(C:I1) IC6224.10(C:O) IC6224.11(D:I0) IC6224.12(D:I1) IC6224.13(D:O) IC6249.1(A:I0) IC6249.2(A:I1) IC6249.3(A:O) IC6249.4(B:I0) IC6249.5(B:I1) IC6249.6(B:O) IC6249.11(D:O) IC6249.12(D:I0) IC6249.13(D:I1) IC6250.4(B:I0) IC6250.5(B:I1) IC6250.6(B:O) IC6250.8(C:O) IC6250.9(C:I0) IC6250.10(C:I1) IC6250.11(D:O) IC6250.12(D:I0) IC6250.13(D:I1) IC6251.1(A:O) IC6251.2(A:I0) IC6251.3(A:I1) IC6251.4(B:O) IC6251.5(B:I0) IC6251.6(B:I1) IC6251.11(D:I0) IC6251.12(D:I1) IC6251.13(D:O) IC6252.3(B:I) IC6252.4(B:O) IC6252.8(D:O) IC6252.9(D:I) IC6252.10(E:O) IC6252.11(E:I) IC6252.12(F:O) IC6252.13(F:I) IC6256.4(B:I0) IC6256.5(B:I1) IC6256.6(B:O) IC6256.8(C:O) IC6256.9(C:I0) IC6256.10(C:I1) IC6256.11(D:O) IC6256.12(D:I0) IC6256.13(D:I1) IC6257.4(B:I0) IC6257.5(B:I1) IC6257.6(B:O) IC6257.8(C:O) IC6257.9(C:I0) IC6257.10(C:I1) IC6257.11(D:O) IC6257.12(D:I0) IC6257.13(D:I1) IC6263.3(B:I) IC6263.4(B:O) IC6263.5(C:I) IC6263.6(C:O) IC6263.8(D:O) IC6263.9(D:I) IC6263.10(E:O) IC6263.11(E:I) IC6263.12(F:O) IC6263.13(F:I)

### Buses
B$12

### Notes on the sheet
- PHI2
- PHI2
- nand7
- carry6 | AVR
- AVRLatch
- DC7 | ACR
- DCLatch
- nor7
- AND/NOR
- ACR
- carry7
- /carry7
- ACLatch
- no carry goes into adder Bit 7,
  but both adder inputs are 1.
  > carry goes out of Bit 7.
- PHI2
- PHI2
- and7
- carry6
- DC7
- AVR
- DCLatch
- AVRLatch
- ACR
- nor7
- carry7
- ACLatch
- carry goes into adder Bit 7, 
  but both adder inputs are 0.
  > no carry goes out of Bit 7.
- Overflow indicator:
  for adder Bit 7,
  input carry is different
  from output carry.
- https://github.com/emu-russia/breaks/blob/master/BreakingNESWiki_DeepL/6502/alu.md
  5:carry_plus_overflow_evaluation

## Sheet 7 of 29
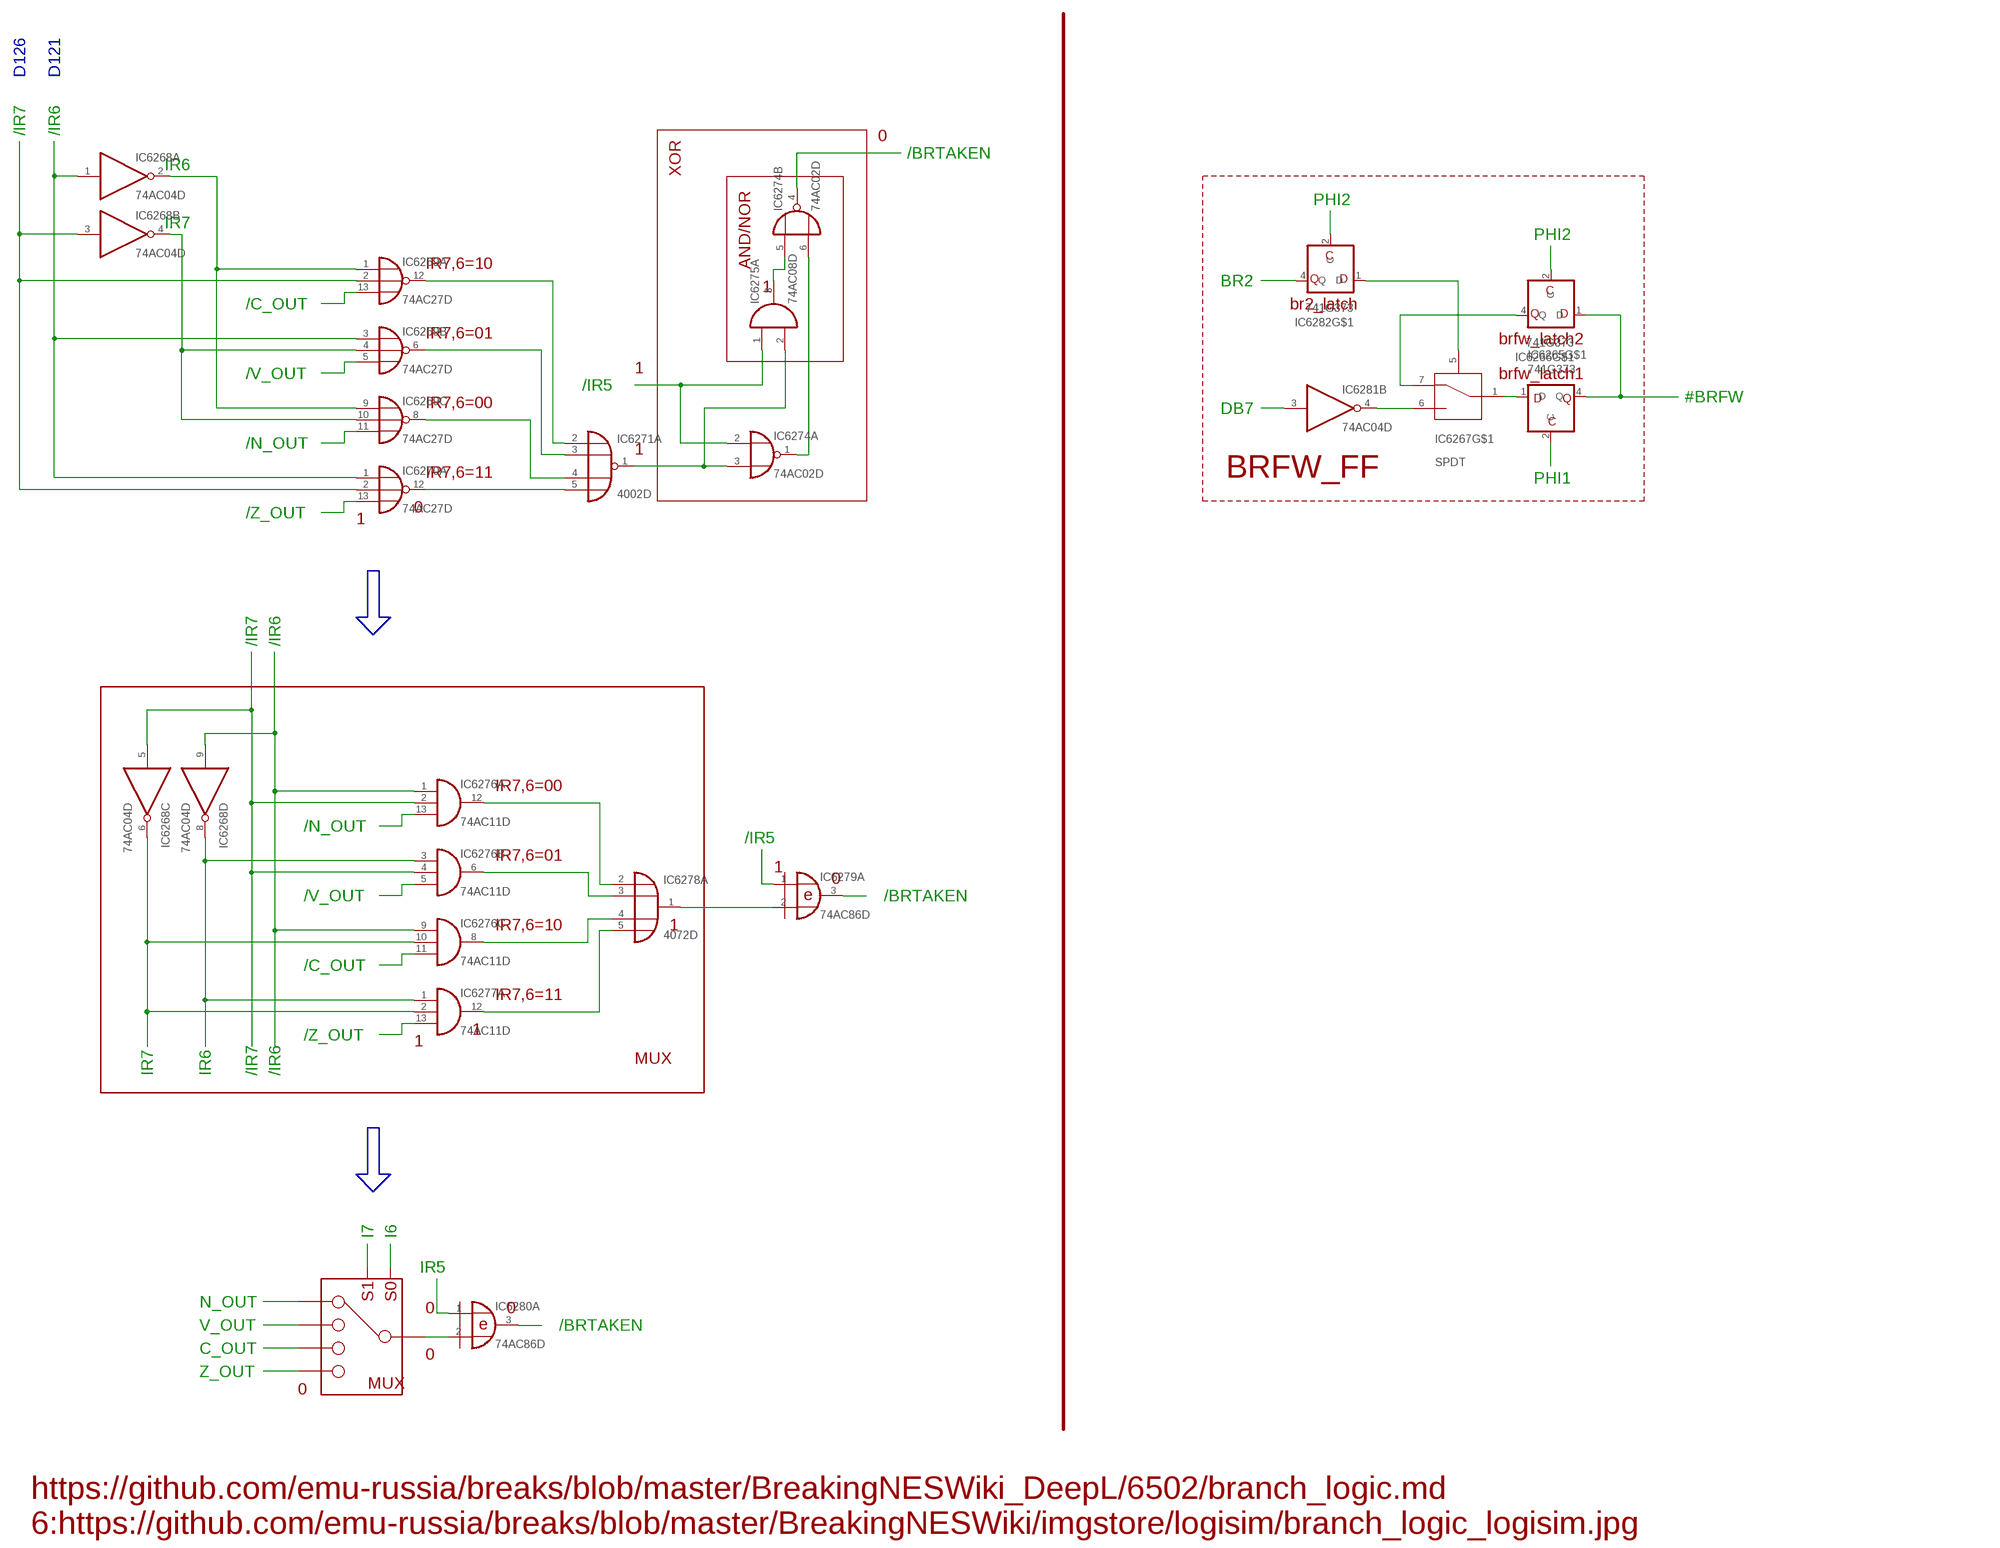
[diagram p7: schematic, sheet 7]

### Parts
IC6265  741G373  [DBV-R-PDSO-G5]
IC6266  741G373  [DBV-R-PDSO-G5]
IC6267  SPDT  [SO8]
IC6268  74AC04D  [SO14]
IC6269  74AC27D  [SO14]
IC6270  74AC27D  [SO14]
IC6271  4002D  [SO14]
IC6274  74AC02D  [SO14]
IC6275  74AC08D  [SO14]
IC6276  74AC11D  [SO14]
IC6277  74AC11D  [SO14]
IC6278  4072D  [SO14]
IC6279  74AC86D  [SO14]
IC6280  74AC86D  [SO14]
IC6281  74AC04D  [SO14]
IC6282  741G373  [DBV-R-PDSO-G5]

### Nets
I3: IC6268.4(B:O) IC6269.4(B:I1) IC6269.10(C:I1)
I4: IC6268.2(A:O) IC6269.1(A:I0) IC6269.9(C:I0)
I6#2: IC6268.1(A:I) IC6269.3(B:I0) IC6270.1(A:I0)
I7#2: IC6268.3(B:I) IC6269.2(A:I1) IC6270.2(A:I1)
N$11126: IC6267.6(NO) IC6281.4(B:O)
N$11127: IC6265.1(D) IC6267.1(Q)
N$11128: IC6266.4(Q) IC6267.7(NC)
N$11129: IC6265.4(Q) IC6266.1(D)
N$11137: IC6265.2(C)
N$11144: IC6266.2(C)
N$11157: IC6267.5(A) IC6282.1(D)
N$11158: IC6269.12(A:O) IC6271.2(A:I0)
N$11165: IC6269.6(B:O) IC6271.3(A:I1)
N$11166: IC6269.8(C:O) IC6271.4(A:I2)
N$11167: IC6270.12(A:O) IC6271.5(A:I3)
N$11172: IC6271.1(A:O) IC6274.3(A:I1) IC6275.2(A:I1)
N$11187: IC6274.1(A:O) IC6274.6(B:I1)
N$11189: IC6274.2(A:I0) IC6275.1(A:I0)
N$11190: IC6269.13(A:I2)
N$11191: IC6269.5(B:I2)
N$11192: IC6269.11(C:I2)
N$11193: IC6274.4(B:O)
N$11194: IC6270.13(A:I2)
N$11195: IC6274.5(B:I0) IC6275.3(A:O)
N$11196: IC6277.13(A:I2)
N$11203: IC6276.13(A:I2)
N$11204: IC6276.5(B:I2)
N$11205: IC6276.11(C:I2)
N$11206: IC6268.6(C:O) IC6276.10(C:I1) IC6277.2(A:I1)
N$11207: IC6268.8(D:O) IC6276.3(B:I0) IC6277.1(A:I0)
N$11208: IC6268.5(C:I) IC6276.2(A:I1) IC6276.4(B:I1)
N$11209: IC6268.9(D:I) IC6276.1(A:I0) IC6276.9(C:I0)
N$11210: IC6277.12(A:O) IC6278.5(A:I3)
N$11211: IC6276.8(C:O) IC6278.4(A:I2)
N$11212: IC6276.6(B:O) IC6278.3(A:I1)
N$11213: IC6276.12(A:O) IC6278.2(A:I0)
N$11214: IC6278.1(A:O) IC6279.2(A:I1)
N$11215: IC6279.1(A:I0)
N$11216: IC6279.3(A:O)
N$11223: IC6280.2(A:I1)
N$11224: IC6280.1(A:I0)
N$11225: IC6280.3(A:O)
N$11226: IC6281.3(B:I)
N$11227: IC6282.4(Q)
N$11228: IC6282.2(C)
Unconnected: IC6268.10(E:O) IC6268.11(E:I) IC6268.12(F:O) IC6268.13(F:I) IC6270.3(B:I0) IC6270.4(B:I1) IC6270.5(B:I2) IC6270.6(B:O) IC6270.8(C:O) IC6270.9(C:I0) IC6270.10(C:I1) IC6270.11(C:I2) IC6271.9(B:I0) IC6271.10(B:I1) IC6271.11(B:I2) IC6271.12(B:I3) IC6271.13(B:O) IC6274.8(C:I0) IC6274.9(C:I1) IC6274.10(C:O) IC6274.11(D:I0) IC6274.12(D:I1) IC6274.13(D:O) IC6275.4(B:I0) IC6275.5(B:I1) IC6275.6(B:O) IC6275.8(C:O) IC6275.9(C:I0) IC6275.10(C:I1) IC6275.11(D:O) IC6275.12(D:I0) IC6275.13(D:I1) IC6277.3(B:I0) IC6277.4(B:I1) IC6277.5(B:I2) IC6277.6(B:O) IC6277.8(C:O) IC6277.9(C:I0) IC6277.10(C:I1) IC6277.11(C:I2) IC6278.9(B:I0) IC6278.10(B:I1) IC6278.11(B:I2) IC6278.12(B:I3) IC6278.13(B:O) IC6279.4(B:I0) IC6279.5(B:I1) IC6279.6(B:O) IC6279.8(C:O) IC6279.9(C:I0) IC6279.10(C:I1) IC6279.11(D:O) IC6279.12(D:I0) IC6279.13(D:I1) IC6280.4(B:I0) IC6280.5(B:I1) IC6280.6(B:O) IC6280.8(C:O) IC6280.9(C:I0) IC6280.10(C:I1) IC6280.11(D:O) IC6280.12(D:I0) IC6280.13(D:I1) IC6281.1(A:I) IC6281.2(A:O) IC6281.5(C:I) IC6281.6(C:O) IC6281.8(D:O) IC6281.9(D:I) IC6281.10(E:O) IC6281.11(E:I) IC6281.12(F:O) IC6281.13(F:I)

### Buses
B$12

### Notes on the sheet
- D126 | D121
- /IR7 | /IR6
- 0
- /BRTAKEN
- IR6
- XOR
- PHI2
- IR7
- PHI2
- IR7,6=10 | AND/NOR
- BR2
- 1
- /C_OUT | br2_latch
- IR7,6=01
- brfw_latch2
- 1
- /V_OUT | brfw_latch1
- /IR5
- #BRFW
- IR7,6=00
- DB7
- /N_OUT
- 1
- IR7,6=11 | BRFW_FF
- PHI1
- 0
- /Z_OUT
- 1
- /IR7 | /IR6
- IR7,6=00
- /N_OUT
- /IR5
- IR7,6=01
- 1
- 0
- /V_OUT | /BRTAKEN
- IR7,6=10 | 1
- /C_OUT
- IR7,6=11
- 1
- /Z_OUT
- 1
- MUX
- IR7 | IR6 | /IR7 | /IR6
- I7 | I6
- IR5
- S1 | S0
- N_OUT
- 0 | 0
- V_OUT | /BRTAKEN
- C_OUT
- 0
- Z_OUT
- MUX
- 0
- https://github.com/emu-russia/breaks/blob/master/BreakingNESWiki_DeepL/6502/branch_logic.md
  6:https://github.com/emu-russia/breaks/blob/master/BreakingNESWiki/imgstore/logisim/branch_logic_logisim.jpg